# Altium project MCU.PrjPcb (part 1 of 3)
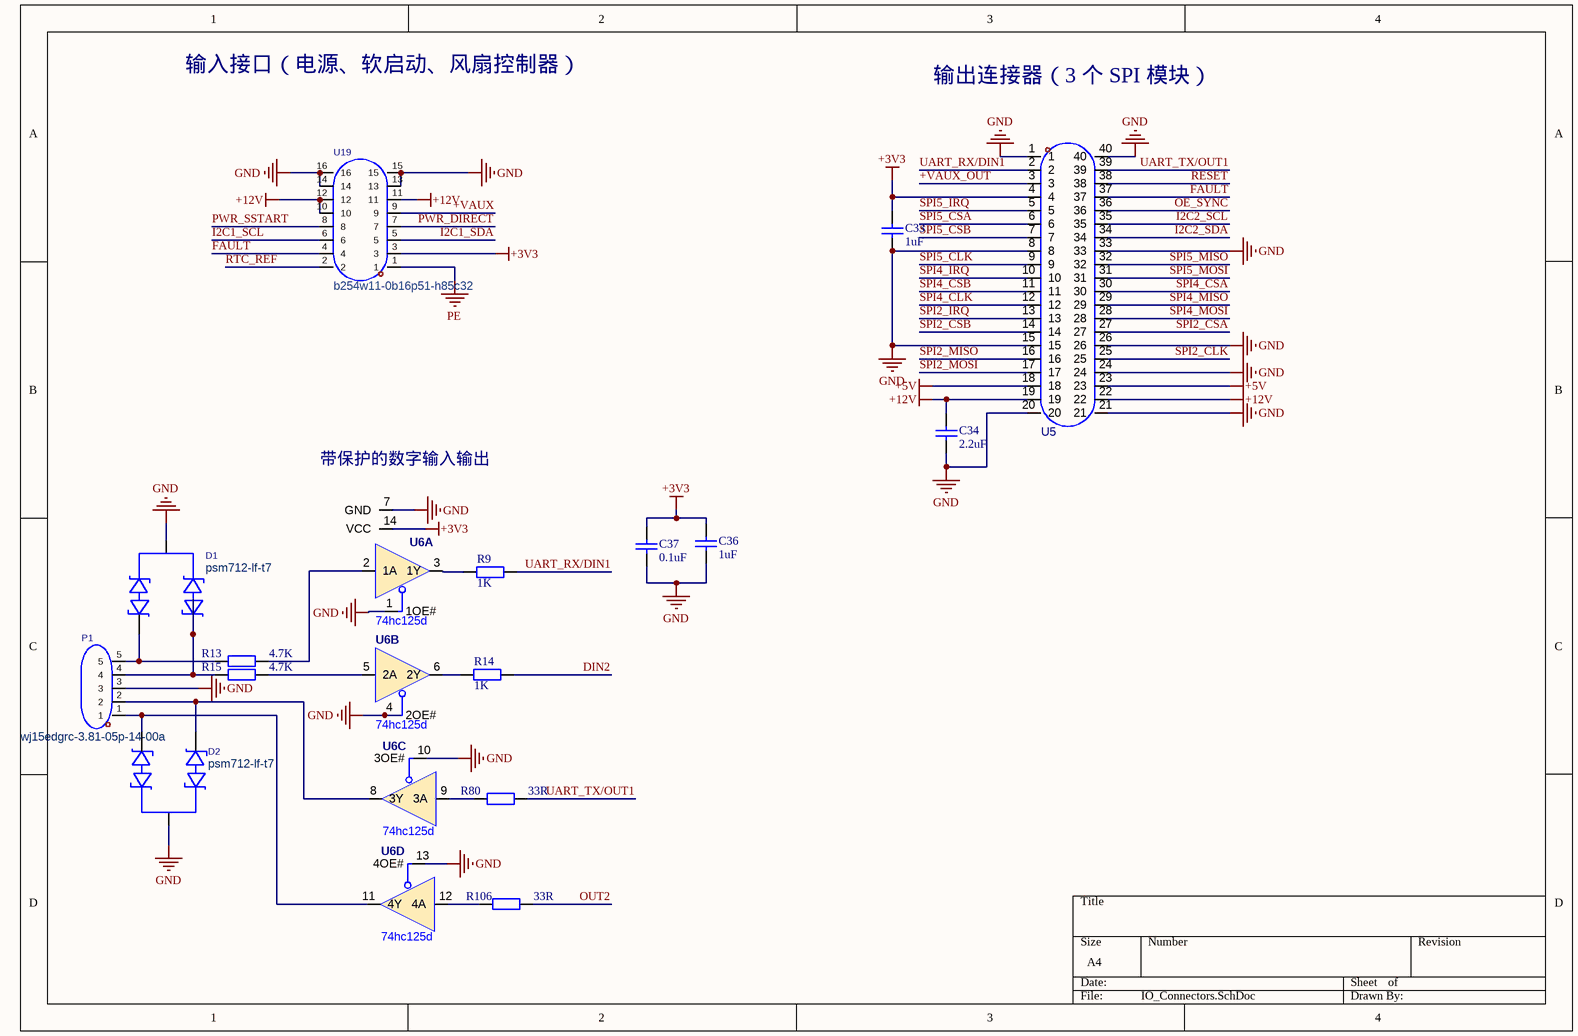
[diagram p0: IO_Connectors.SchDoc]
18 sheets, 591 parts. Net scope: global (net labels, ports and power ports of the same name join across sheets).
Board file: MCU.PcbDoc
Sheets:
  MCU.SchDoc
  IO_Connectors.SchDoc
  SDRAM，JTAG，I2C EEPROM，SD Card.SchDoc
  USB,TFT LCD,touchscreen,audio amplifier.SchDoc
  Ethernet_PHY_1.SchDoc
  Ethernet_PHY_2.SchDoc
  TYPE-C.SchDoc
  CAN.SchDoc
  EMMC.SchDoc
  OSPI_FLASH、EEPROM.SchDoc
  BOOT_MODE_BUFFER&SWITCHES.SchDoc
  MIMP.SchDoc
  DDR4.SchDoc
  sys-power.SchDoc
  bootload_wifi.SchDoc
  SoC POWER SUPPLY.SchDoc
  PERIPHERAL POWER SUPPLY.SchDoc
  VCC3V3_SYS & VCC_5V0 POWER SUPPLY.SchDoc

## Sheet MCU.SchDoc
size 381 x 241 mm; SheetNumber: 1; SheetTotal: 10

## Sheet IO_Connectors.SchDoc
size A4; SheetNumber: 2; SheetTotal: 17

### Parts
(Parts that share a designator on the sheet are numbered #1, #2 ... from top to bottom, then left to right.)
C33  1uF  [C0603]
C34  2.2uF  [C0603]
C36  1uF  [C0603]
C37#1  0.1uF  [C0603]
D1  psm712-lf-t7  [SOT-23-3_L3.0-W1.7-P0.95-LS2.9-BR]
D2  psm712-lf-t7  [SOT-23-3_L3.0-W1.7-P0.95-LS2.9-BR]
P1  wj15edgrc-3.81-05p-14-00a  [CONN-TH_5P-P3.81_WJ15EDGRC-3.81-5P]
R9  1K  [R0603]
R13  4.7K  [R0603]
R14  1K  [R0603]
R15  4.7K  [R0603]
R80  33R  [R0603]
R106  33R  [R0603]
U5  ds1024-2x20r2  [HDR-TH_40P-P2.54-H-F-R2-C20-S2.54-W8.5]  (value not drawn)
U6  74hc125d  [SOIC-14_L8.7-W3.9-P1.27-LS6.0-BL]  (parts A,B,C,D of 4)
U19  b254w11-0b16p51-h85c32  [HDR-TH_16P-P2.54-H-F-R2-C8-W8.5]

### Nets
+3V3: C33.1 C36.2 C37#1.2 U5.4 U6.14(VCC) U19.3
+5V: U5.18 U5.23
+12V: C34.2 U5.19 U5.22 U19.10 U19.11 U19.12
GND: C33.2 C34.1 C36.1 C37#1.1 D1.3(K) D2.3(K) P1.3 U5.1 U5.8 U5.15 U5.20 U5.21 U5.24 U5.26 U5.33 U5.40 U6.1(1OE#) U6.4(2OE#) U6.7(GND) U6.10(3OE#) U6.13(4OE#) U19.13 U19.14 U19.15 U19.16
PE: U19.1
+VAUX: U19.9
+VAUX_OUT: U5.3
DIN2: R14.1
FAULT: U5.37 U19.4
I2C1_SCL: U19.6
I2C1_SDA: U19.5
I2C2_SCL: U5.35
I2C2_SDA: U5.34
OE_SYNC: U5.36
OUT2: R106.2
PWR_DIRECT: U19.7
PWR_SSTART: U19.8
RESET: U5.38
RTC_REF: U19.2
SPI2_CLK: U5.25
SPI2_CSA: U5.27
SPI2_CSB: U5.14
SPI2_IRQ: U5.13
SPI2_MISO: U5.16
SPI2_MOSI: U5.17
SPI4_CLK: U5.12
SPI4_CSA: U5.30
SPI4_CSB: U5.11
SPI4_IRQ: U5.10
SPI4_MISO: U5.29
SPI4_MOSI: U5.28
SPI5_CLK: U5.9
SPI5_CSA: U5.6
SPI5_CSB: U5.7
SPI5_IRQ: U5.5
SPI5_MISO: U5.32
SPI5_MOSI: U5.31
UART_RX/DIN1: R9.1 U5.2
UART_TX/OUT1: R80.2 U5.39
NetD1_1: D1.1(A1) P1.5 R13.1
NetD1_2: D1.2(A1) P1.4 R15.1
NetD2_1: D2.1(A1) P1.2 U6.8(3Y)
NetD2_2: D2.2(A1) P1.1 U6.11(4Y)
NetR9_2: R9.2 U6.3(1Y)
NetR13_2: R13.2 U6.2(1A)
NetR14_2: R14.2 U6.6(2Y)
NetR15_2: R15.2 U6.5(2A)
NetR80_1: R80.1 U6.9(3A)
NetR106_1: R106.1 U6.12(4A)

### Notes on the sheet
- 输入接口（电源、软启动、风扇控制器）
- 输出连接器（3 个 SPI 模块）
- (near U6) 带保护的数字输入输出

### Library data of the parts
C33 C34 C36 C37#1 = C0603: Capacitor; Value: 104; Published: 8-Jun-2000; LatestRevisionDate: 17-Jul-2002; LatestRevisionNote: Re-released for DXP Platform.; Publisher: Altium Limited
D1 D2 = psm712-lf-t7: 极性:单向;反向截止电压(Vrwm):12V;钳位电压:19V;峰值脉冲电流(Ipp):34A@8/20us；30A@8/20us;峰值脉冲功率(Ppp):600W@8/20us;击穿电压(VBR):13.3V;; Manufacturer: PROTEK; AddInBom: yes; ModelId: 89cb27a44ab2466697082bb9fd73a7d0; ModelName: SOT-23-3L_L2.9-W1.6-H1.1-LS2.8-P0.95; ModelTransform: 114.173,110.236,0,90,0,0,0,0,0; Polarity: 单向; Reverse Stand-Off Voltage (Vrwm): 12V; Clamping Voltage: 19V; Voltage - Breakdown: 13.3V; Reverse Leakage Current (Ir): 1uA；20uA; level of protection: IEC 61000-4-4；IEC 61000-4-5；IEC 61000-4-2; Type: TVS; Junction Capacitance: 75pF; Symbol: PSM712-LF-T7; LCSC Part Name: 单向TVS 12V截止 峰值浪涌电流：34A@8/20us 30A@8/20us; SupplierPart: C32677; ManufacturerPart: PSM712-LF-T7; Supplier Footprint: SOT-23; JLCPCB Part Class: Basic Part; Datasheet: https://item.szlcsc.com/datasheet/PSM712-LF-T7/33642.html; Supplier: LCSC; ConvertToPcb: yes; FootprintName: SOT-23-3_L3.0-W1.7-P0.95-LS2.9-BR; Peak Pulse Current (Ipp): 34A@8/20us；30A@8/20us; Peak Pulse Power Dissipation (Ppp): 600W@8/20us; Operating Temperature: -55℃~+150℃
P1 = wj15edgrc-3.81-05p-14-00a: 连接器类型:板端/插座-闭口;固定方式:无固定装置;结构:1x5P;间距:3.81mm;颜色:绿色;安装方式:弯插;排数:1;每排PIN数:5;额定电流:8A;额定电压:300V;线规 - AWG:-;线规 - 平方毫米:-;工作温度:-40℃~+105℃;; Manufacturer: KANGNEX(康奈克斯电气); Symbol: WJ15EDGRC-3.81-5P; AddInBom: yes; ModelId: 1f5bfc586d7a497a94e16b2138b9ad12; ModelName: CONN-TH_WJ3.81-WI-5P; ModelTransform: 784.64406,360.2355,0,0,0,0,-0.197,-118.11,-137.795; Number of Positions or Pins: 1x5P; Pitch: 3.81mm; Number of PINs Per Row: 5; Current Rating: 8A; Voltage Rating (Max): 300V; LCSC Part Name: 无固定装置 1x5P 3.81mm 排数:1 每排P数:5; SupplierPart: C8395; ManufacturerPart: WJ15EDGRC-3.81-05P-14-00A; Supplier Footprint: 弯插,P=3.81mm; JLCPCB Part Class: Extended Part; Datasheet: https://item.szlcsc.com/datasheet/WJ15EDGRC-3.81-05P-14-00A/8889.html; Supplier: LCSC; ConvertToPcb: yes; FootprintName: CONN-TH_5P-P3.81_WJ15EDGRC-3.81-5P; Connector Type: 板端/插座-闭口; Termination Style: 无固定装置; Color: 绿色; Mounting Type: 弯插; Number of Pins: 5P; Number of Rows: 1; Wire Gauge - AWG: -; Wire Gauge - mm2: -; Operating Temperature: -40℃~+105℃; Connection Type: -; Outlet Direction (Vertical Basis): -
R9 R13-R15 R80 R106 = R0603: Resistor; Published: 8-Jun-2000; LatestRevisionDate: 17-Jul-2002; LatestRevisionNote: Re-released for DXP Platform.; Publisher: Altium Limited
U5 = ds1024-2x20r2: 插孔结构:2x20P;间距:2.54mm;行距:2.54mm;圆孔/方孔:方孔;安装方式:弯插;排数:双排;总孔位数:40P;额定电流:3A;额定电压:250V;插孔方向:侧面;塑高:2.5mm;触头镀层:金镍;工作温度:-40℃~+105℃;; Manufacturer: CONNFLY; AddInBom: yes; ModelId: a9ccadb72efd4c37a205c7e50d3d2ca6; ModelTransform: 2023.618,499.999,0,180,0,0,0,192.917,-125.984; Holes Structure: 2x20P; Pitch: 2.54mm; Circular Hole / Square Hole: 方孔; Number of Positions: 40P; Current Rating: 3A; Voltage Rating (Max): 250V; Holes Direction: 侧面; Symbol: DS1024-2X20R2; LCSC Part Name: 黑色 2x20P 间距:2.54mm 弯插; SupplierPart: C7509545; ManufacturerPart: DS1024-2x20R2; Supplier Footprint: 弯插,P=2.54mm; JLCPCB Part Class: Extended Part; Datasheet: https://item.szlcsc.com/datasheet/DS1024-2x20R2/8601981.html; Supplier: LCSC; ConvertToPcb: yes; FootprintName: HDR-TH_40P-P2.54-H-F-R2-C20-S2.54-W8.5; ModelName: HDR-TH_40P-P2.54-H-F-R2-C20-S2.54-W8.5; Row Spacing: 2.54mm; Mounting Type: 弯插; Number of Rows: 双排; Insulation Height: 2.5mm; Contact Plating: 金镍; Operating Temperature: -40℃~+105℃
U6 = 74hc125d_c52140399: 输入类型:标准CMOS;工作电压:2V~6V;元件数:4;每个元件位数:-;灌电流(IOL):7.8mA;拉电流(IOH):7.8mA;; Manufacturer: MDD(辰达半导体); AddInBom: yes; ModelId: 8dbf5b715d42428c85558507ae5a252b; ModelName: SOIC-14_L8.6-W3.9-H1.8-LS6.0-P1.27; ModelTransform: 338.583,236.22,0,0,0,0,0,0.001,0; Input type: 标准CMOS; output type: 三态; Voltage - Supply: 2V~6V; Number of Elements: 4; Channel Type: 单向; Current - Output Low(IOL): 7.8mA; Logic Family: 74HC; Quiescent Current: 40uA; Propagation Delay: 20ns@6.0V,15pF; LCSC Part Name: 带三态输出的四路缓冲器/线路驱动器; SupplierPart: C52140399; ManufacturerPart: 74HC125D; Supplier Footprint: SOP-14L; JLCPCB Part Class: Extended Part; Datasheet: https://item.szlcsc.com/datasheet/74HC125D/54938128.html; Supplier: LCSC; ConvertToPcb: yes; SymbolName: 74HC125D_C52140399; FootprintName: SOIC-14_L8.7-W3.9-P1.27-LS6.0-BL; Number of Bits per Element: -; Current - Output High(IOH): 7.8mA; Operating Temperature: -40℃~+125℃; Features: 输出使能
U19 = b254w11-0b16p51-h85c32: 插孔结构:2x8P;间距:2.54mm;行距:2.54mm;圆孔/方孔:方孔;安装方式:弯插;排数:双排;总孔位数:16P;额定电流:3A;插孔方向:侧面;塑高:8.5mm;触头材质:黄铜;触头镀层:金;工作温度:-40℃~+105℃;; Manufacturer: JXTCONN(聚兴泰); AddInBom: yes; ModelId: 3769f9c01991404e933d2dcd4e3e6b52; ModelTransform: 823.62,499.999,0,0,0,0,0,-192.913,-125.984; Holes Structure: 2x8P; Pitch: 2.54mm; Circular Hole / Square Hole: 方孔; Number of Positions: 16P; Current Rating: 3A; Holes Direction: 侧面; PIN Length: 3.2mm; Symbol: B254W11-0B16P51-H85C32; LCSC Part Name: 插孔结构：2x8P 间距：2.54mm 安装方式：弯插 排数：双排 方孔; SupplierPart: C49297019; ManufacturerPart: B254W11-0B16P51-H85C32; Supplier Footprint: 弯插,P=2.54mm; JLCPCB Part Class: Extended Part; Datasheet: https://item.szlcsc.com/datasheet/B254W11-0B16P51-H85C32/51751274.html; Supplier: LCSC; ConvertToPcb: yes; FootprintName: HDR-TH_16P-P2.54-H-F-R2-C8-W8.5; ModelName: HDR-TH_16P-P2.54-H-F-R2-C8-W8.5; Row Spacing: 2.54mm; Mounting Type: 弯插; Number of Rows: 双排; Insulation Height: 8.5mm; Contact Material: 黄铜; Contact Plating: 金; Operating Temperature: -40℃~+105℃

## Sheet SDRAM，JTAG，I2C EEPROM，SD Card.SchDoc
size A4; SheetNumber: 3; SheetTotal: 16
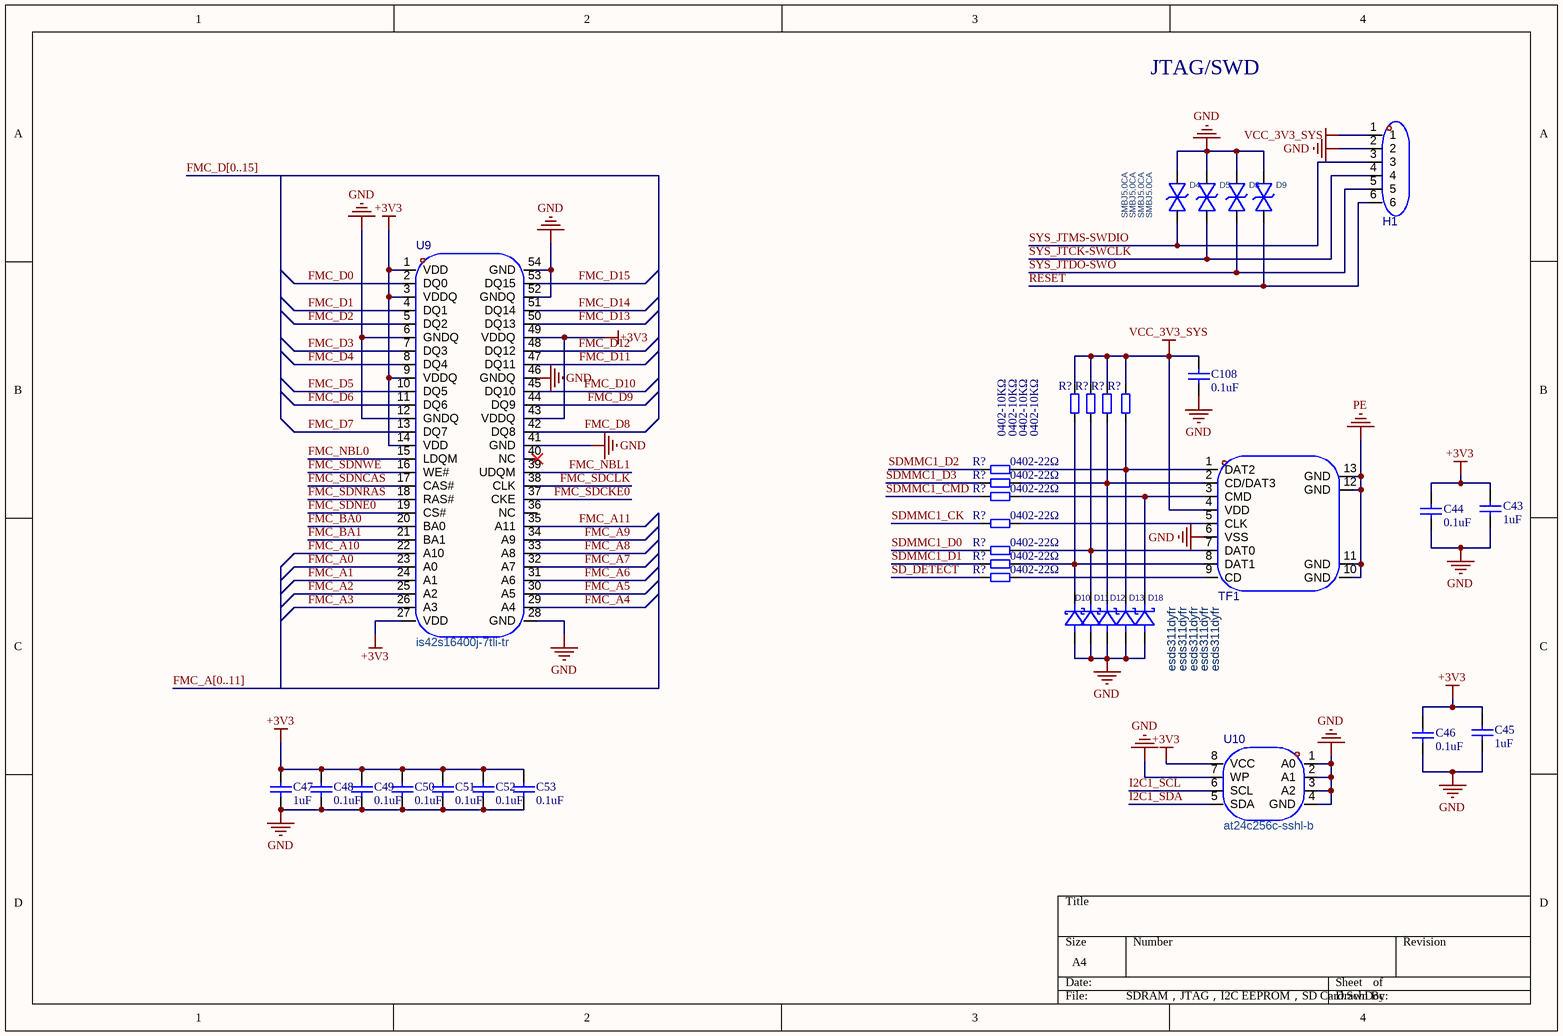
[diagram p1: SDRAM，JTAG，I2C EEPROM，SD Card.SchDoc]

### Parts
(Parts that share a designator on the sheet are numbered #1, #2 ... from top to bottom, then left to right.)
C43  1uF  [C0603]
C44  0.1uF  [C0603]
C45  1uF  [C0603]
C46  0.1uF  [C0603]
C47  1uF  [C0603]
C48  0.1uF  [C0603]
C49  0.1uF  [C0603]
C50  0.1uF  [C0603]
C51  0.1uF  [C0603]
C52  0.1uF  [C0603]
C53  0.1uF  [C0603]
C108  0.1uF  [C0603]
D4  SMBJ5.0CA  [SMB_L4.6-W3.6-LS5.3-BI]
D5  SMBJ5.0CA  [SMB_L4.6-W3.6-LS5.3-BI]
D8  SMBJ5.0CA  [SMB_L4.6-W3.6-LS5.3-BI]
D9  SMBJ5.0CA  [SMB_L4.6-W3.6-LS5.3-BI]
D10  esds311dyfr  [SOD-323_L1.7-W1.3-LS2.6-RD-1]
D11  esds311dyfr  [SOD-323_L1.7-W1.3-LS2.6-RD-1]
D12  esds311dyfr  [SOD-323_L1.7-W1.3-LS2.6-RD-1]
D13  esds311dyfr  [SOD-323_L1.7-W1.3-LS2.6-RD-1]
D18  esds311dyfr  [SOD-323_L1.7-W1.3-LS2.6-RD-1]
H1  pz254v-11-06p  [HDR-TH_6P-P2.54-V-M]  (value not drawn)
R?#1  0402-10KΩ  [R0402]
R?#2  0402-10KΩ  [R0402]
R?#3  0402-10KΩ  [R0402]
R?#4  0402-10KΩ  [R0402]
R?#5  0402-22Ω  [R0402]
R?#6  0402-22Ω  [R0402]
R?#7  0402-22Ω  [R0402]
R?#8  0402-22Ω  [R0402]
R?#9  0402-22Ω  [R0402]
R?#10  0402-22Ω  [R0402]
R?#11  0402-22Ω  [R0402]
TF1  tf-card h1.8  [TF-SMD_TF-CARD-H1.8]  (value not drawn)
U9  is42s16400j-7tli-tr  [TSOP-54_L22.2-W10.2-P0.80-LS11.8-BL]
U10  at24c256c-sshl-b  [SOIC-8_L4.9-W3.9-P1.27-LS6.0-BL]

### Nets
+3V3: C43.2 C44.2 C45.2 C46.2 C47.2 C48.2 C49.2 C50.2 C51.2 C52.2 C53.2 U9.1(VDD) U9.3(VDDQ) U9.9(VDDQ) U9.14(VDD) U9.27(VDD) U9.43(VDDQ) U9.49(VDDQ) U10.8(VCC)
GND: C43.1 C44.1 C45.1 C46.1 C47.1 C48.1 C49.1 C50.1 C51.1 C52.1 C53.1 C108.1 D4.2 D5.2 D8.2 D9.2 D10.2(A) D11.2(A) D12.2(A) D13.2(A) D18.2(A) H1.2 TF1.6(VSS) U9.6(GNDQ) U9.12(GNDQ) U9.28(GND) U9.41(GND) U9.46(GNDQ) U9.52(GNDQ) U9.54(GND) U10.1(A0) U10.2(A1) U10.3(A2) U10.4(GND) U10.7(WP)
PE: TF1.10(GND) TF1.11(GND) TF1.12(GND) TF1.13(GND)
VCC_3V3_SYS: C108.2 H1.1 R?#1.2 R?#2.2 R?#3.2 R?#4.2 TF1.4(VDD)
FMC_A0: U9.23(A0)
FMC_A1: U9.24(A1)
FMC_A2: U9.25(A2)
FMC_A3: U9.26(A3)
FMC_A4: U9.29(A4)
FMC_A5: U9.30(A5)
FMC_A6: U9.31(A6)
FMC_A7: U9.32(A7)
FMC_A8: U9.33(A8)
FMC_A9: U9.34(A9)
FMC_A10: U9.22(A10)
FMC_A11: U9.35(A11)
FMC_BA0: U9.20(BA0)
FMC_BA1: U9.21(BA1)
FMC_D0: U9.2(DQ0)
FMC_D1: U9.4(DQ1)
FMC_D2: U9.5(DQ2)
FMC_D3: U9.7(DQ3)
FMC_D4: U9.8(DQ4)
FMC_D5: U9.10(DQ5)
FMC_D6: U9.11(DQ6)
FMC_D7: U9.13(DQ7)
FMC_D8: U9.42(DQ8)
FMC_D9: U9.44(DQ9)
FMC_D10: U9.45(DQ10)
FMC_D11: U9.47(DQ11)
FMC_D12: U9.48(DQ12)
FMC_D13: U9.50(DQ13)
FMC_D14: U9.51(DQ14)
FMC_D15: U9.53(DQ15)
FMC_NBL0: U9.15(LDQM)
FMC_NBL1: U9.39(UDQM)
FMC_SDCKE0: U9.37(CKE)
FMC_SDCLK: U9.38(CLK)
FMC_SDNCAS: U9.17(CAS#)
FMC_SDNE0: U9.19(CS#)
FMC_SDNRAS: U9.18(RAS#)
FMC_SDNWE: U9.16(WE#)
I2C1_SCL: U10.6(SCL)
I2C1_SDA: U10.5(SDA)
RESET: D9.1 H1.6
SD_DETECT: R?#11.1
SDMMC1_CK: R?#8.1
SDMMC1_CMD: R?#7.1
SDMMC1_D0: R?#9.1
SDMMC1_D1: R?#10.1
SDMMC1_D2: R?#5.1
SDMMC1_D3: R?#6.1
SYS_JTCK-SWCLK: D5.1 H1.4
SYS_JTDO-SWO: D8.1 H1.5
SYS_JTMS-SWDIO: D4.1 H1.3
NetD10_1: D10.1(K) R?#1.1 R?#10.2 TF1.8(DAT1)
NetD11_1: D11.1(K) R?#2.1 R?#9.2 TF1.7(DAT0)
NetD12_1: D12.1(K) R?#3.1 R?#6.2 TF1.2(CD/DAT3)
NetD13_1: D13.1(K) R?#4.1 R?#5.2 TF1.1(DAT2)
NetD18_1: D18.1(K) R?#7.2 TF1.3(CMD)
NetR?#8_2: R?#8.2 TF1.5(CLK)
NetR?#11_2: R?#11.2 TF1.9(CD)

Not connected (* = marked no-connect by the designer): U9 36(NC) 40(NC)*

### Buses and harness runs
bus \ = FMC_A[0..11]
bus FMC_D[0..15]

### Notes on the sheet
- JTAG/SWD

### Library data of the parts
C43-C53 C108 = C0603: Capacitor; Value: 104; Published: 8-Jun-2000; LatestRevisionDate: 17-Jul-2002; LatestRevisionNote: Re-released for DXP Platform.; Publisher: Altium Limited
D4 D5 D8 D9 = SMBJ5.0CA_C19077559: PWR 5V; Manufacturer: 宏嘉诚; Add into BOM: yes; Polarity: 双向; Clamping Voltage: 9.2V; Peak Pulse Current (Ipp): 65.22A; Peak Pulse Power Dissipation (Ppp): 600W; Voltage - Breakdown: 7V; Reverse Leakage Current (Ir): 800uA; Type: TVS; Symbol: SMBJ5.0CA_C19077559; Device: SMBJ5.0CA_C19077559; LCSC Part Name: SMBJ5.0CA; Supplier Part: C19077559; Manufacturer Part: SMBJ5.0CA; Supplier Footprint: SMB; JLCPCB Part Class: Extended Part; Datasheet: https://atta.szlcsc.com/upload/public/pdf/source/20250107/474F05451FC8AB27D7FA0238914F96F6.pdf; Supplier: LCSC; Convert to PCB: yes; Reverse Stand-Off Voltage (Vrwm): 5V; Operating Temperature: -
D10-D13 D18 = esds311dyfr: 极性:单向;反向截止电压(Vrwm):3.6V;钳位电压:7.7V;峰值脉冲电流(Ipp):25A@8/20us;峰值脉冲功率(Ppp):170W@8/20us;击穿电压(VBR):7.5V;; Manufacturer: TI(德州仪器); AddInBom: yes; ModelId: eba151483b2844ffacda3a6d97308fa1; ModelTransform: 100.394,49.2125,0,0,0,0,0,0,0; Polarity: 单向; Reverse Stand-Off Voltage (Vrwm): 3.6V; Clamping Voltage: 7.7V; Voltage - Breakdown: 7.5V; Reverse Leakage Current (Ir): 5nA; Number of Channels: 单路; level of protection: IEC 61000-4-4；IEC 61000-4-5；IEC 61000-4-2; Type: TVS; Junction Capacitance: 4.5pF; LCSC Part Name: 单向TVS 3.6V截止 峰值浪涌电流：25A@8/20us; SupplierPart: C30938562; ManufacturerPart: ESDS311DYFR; Supplier Footprint: SOD-323; JLCPCB Part Class: Extended Part; Datasheet: https://www.ti.com.cn/cn/lit/ds/symlink/esds311.pdf?ts=1736913524660&ref_url=https%253A%252F%252Fwww.ti.com.cn%252Fsitesearch%252Fzh-cn%252Fdocs%252Funiversalsearch.tsp%253FlangPref%253Dzh-CN%2526nr%253D9%2526searchTerm%253DESDS311DYFR; Supplier: LCSC; ConvertToPcb: yes; SymbolName: ESDS311DYFR; FootprintName: SOD-323_L1.7-W1.3-LS2.6-RD-1; ModelName: SOD-323_L1.7-W1.3-LS2.6-RD-1; Peak Pulse Current (Ipp): 25A@8/20us; Peak Pulse Power Dissipation (Ppp): 170W@8/20us; Operating Temperature: -40℃~+125℃
H1 = pz254v-11-06p: 插针结构:1x6P;间距:2.54mm;行距:-;圆针/方针:方针;安装方式:直插;排数:单排;总PIN位数:6P;额定电流:3A;额定电压:250V;配合针长度:6mm;塑高:2.5mm;端接针长度:3mm;触头材质:黄铜;触头镀层:-;工作温度:-40℃~+105℃;颜色:黑色;; Manufacturer: XFCN(兴飞); AddInBom: yes; ModelId: 66a147c6933d4029b68665bbcd1e2924; ModelName: HDR-TH_6P-P2.54-M-LI-1X6P; ModelTransform: 590.1563,98.425,0,0,0,0,0,0,-118.11; Pin Structure: 1x6P; Pitch: 2.54mm; Circluar Pins/Square Pins: 方针; Current Rating: 3A; Voltage Rating (Max): 250V; Symbol: PZ254V-11-06P; LCSC Part Name: 1x6P 间距:2.54mm 方针 直插; SupplierPart: C492405; ManufacturerPart: PZ254V-11-06P; Supplier Footprint: 插件,P=2.54mm; JLCPCB Part Class: Extended Part; Datasheet: https://item.szlcsc.com/datasheet/PZ254V-11-06P/502961.html; Supplier: LCSC; ConvertToPcb: yes; FootprintName: HDR-TH_6P-P2.54-V-M; Row Spacing: -; Mounting Type: 直插; Number of Rows: 单排; Number of Pins: 6P; Length of Mating Pin: 6mm; Insulation Height: 2.5mm; Length of End Connection Pin: 3mm; Contact Material: 黄铜; Contact Plating: -; Operating Temperature: -40℃~+105℃; Color: 黑色
R?#1-R?#11 = R0402: 片式电阻; 物料描述: 片式电阻器-0805-10KΩ-5%-JT; 物料号: NA
TF1 = tf-card h1.8: 卡连接方式:自弹式;卡类型:MicroSD卡(TF卡);连接器类型:卡座;本体最大高度:1.8mm;工作温度:-40℃~+70℃;; Manufacturer: SHOU HAN(首韩); AddInBom: yes; ModelId: 9b9c093eaf784fafb0b50515d8d92d39; ModelTransform: 631.8885,594.487,0,0,0,0,-0.002,-75.432,-23.622; Card Connection Mode: 自弹式; Connector Type: 卡座; Symbol: TF-CARD H1.8; LCSC Part Name: 9P，自弹式TF卡座; SupplierPart: C7529389; ManufacturerPart: TF-CARD H1.8; Supplier Footprint: SMD; JLCPCB Part Class: Extended Part; Datasheet: https://item.szlcsc.com/datasheet/TF-CARD%2520H1.8/8629776.html; Supplier: LCSC; ConvertToPcb: yes; FootprintName: TF-SMD_TF-CARD-H1.8; ModelName: TF-SMD_TF-CARD-H1.8; Card Type: MicroSD卡(TF卡); Additional Card Detection Pins: -; Supplementary Features: -; Height Above Board: 1.8mm; Operating Temperature: -40℃~+70℃
U9 = is42s16400j-7tli-tr: 存储容量:64Mbit;时钟频率(fc):200MHz;; Manufacturer: ISSI(美国芯成); AddInBom: yes; ModelId: 700c07346ffc4ca1812a693d2a0f333f; ModelName: TSOP-54_L22.2-W10.2-H1.2-LS11.8-P0.80; ModelTransform: 464.567,872.538,0,90,0,0,0,-0.0005,0; Memory Size: 64Mbit; Clock Frequency: 200MHz; Voltage - Supply: 3V~3.6V; Symbol: IS42S16400J-7TLI; LCSC Part Name: 停产 64Mb同步动态随机存取存储器; SupplierPart: C94865; ManufacturerPart: IS42S16400J-7TLI-TR; Supplier Footprint: TSOPII-54-10.2mm; JLCPCB Part Class: Extended Part; Datasheet: https://item.szlcsc.com/datasheet/IS42S16400J-7TLI-TR/96065.html; Supplier: LCSC; ConvertToPcb: yes; FootprintName: TSOP-54_L22.2-W10.2-P0.80-LS11.8-BL; Operating Temperature: -40℃~+85℃
U10 = at24c256c-sshl-b_c615461: 接口类型:I2C;存储容量:256Kbit;时钟频率(fc):1MHz;; Manufacturer: MICROCHIP(美国微芯); AddInBom: yes; ModelId: e81d2f7d937b4a6ab1dca543ff5d56a4; ModelName: SOIC-8_L4.9-W3.9-H1.7-LS6.0-P1.27; ModelTransform: 192.913,236.22,0,0,0,0,0,0,0; Interface: I2C; Clock Frequency: 1MHz; Write Cycle Time(Tw): 5ms; Data Retention - TDR (Year): 100年; Write Cycle Endurance: 100万次; Voltage - Supply: 1.7V~5.5V; Symbol: AT24C256C-SSHL-B; LCSC Part Name: 支持I²C接口的串行EEPROM; SupplierPart: C615461; ManufacturerPart: AT24C256C-SSHL-B; Supplier Footprint: SOIC-8; JLCPCB Part Class: Extended Part; Datasheet: https://item.szlcsc.com/datasheet/AT24C256C-SSHL-B/645439.html; Supplier: LCSC; ConvertToPcb: yes; FootprintName: SOIC-8_L4.9-W3.9-P1.27-LS6.0-BL; Memory Size: 256Kbit; Features: 内置上电复位(POR)；硬件写保护功能；噪声抑制功能; Operating Temperature: -40℃~+85℃

## Sheet USB,TFT LCD,touchscreen,audio amplifier.SchDoc
size A4; SheetNumber: 4; SheetTotal: 18
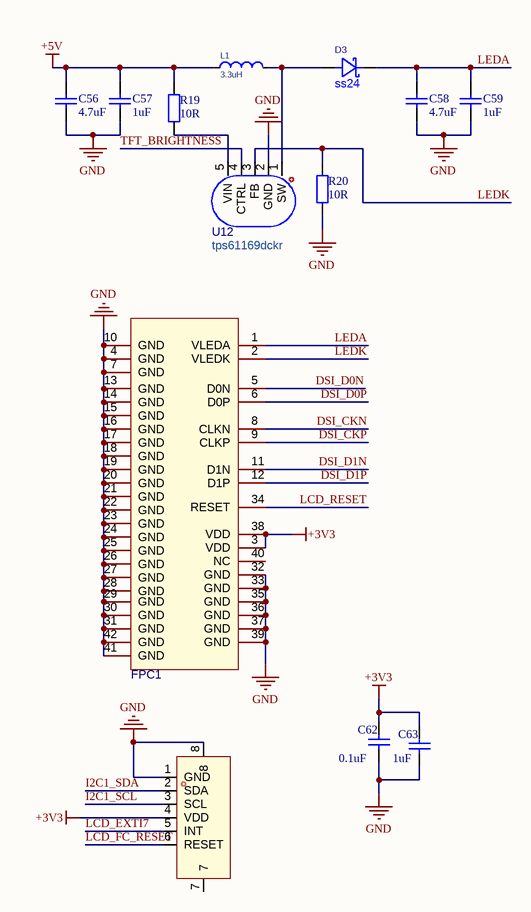
[diagram p2: USB,TFT LCD,touchscreen,audio amplifier.SchDoc]

### Parts
C56  4.7uF  [C0603]
C57  1uF  [C0603]
C58  4.7uF  [C0603]
C59  1uF  [C0603]
C62  0.1uF  [C0603]
C63  1uF  [C0603]
D3  ss24  [SMA_L4.3-W2.6-LS5.0-FD]
FPC1  afc01-s40fca-00  [FPC-SMD_AFC01-S40FCA-00]  (value not drawn)
FPC2  fpc-05f-6ph20  [FPC-SMD_6P-P0.50_XUNPU_FPC-05F-6PH20]  (value not drawn)
L1  3.3uH  [IND-SMD_L3.9-W3.9-1]
R19  10R  [R0603]
R20  10R  [R0603]
U12  tps61169dckr  [SC-70-5_L2.1-W1.3-P0.65-LS2.1-BR]

### Nets
+3V3: C62.1 C63.1 FPC1.3(VDD) FPC1.38(VDD) FPC2.4(VDD)
+5V: C56.2 C57.2 L1.1 R19.2
GND: C56.1 C57.1 C58.1 C59.1 C62.2 C63.2 FPC1.4(GND) FPC1.7(GND) FPC1.10(GND) FPC1.13(GND) FPC1.14(GND) FPC1.15(GND) FPC1.16(GND) FPC1.17(GND) FPC1.18(GND) FPC1.19(GND) FPC1.20(GND) FPC1.21(GND) FPC1.22(GND) FPC1.23(GND) FPC1.24(GND) FPC1.25(GND) FPC1.26(GND) FPC1.27(GND) FPC1.28(GND) FPC1.29(GND) FPC1.30(GND) FPC1.31(GND) FPC1.32(GND) FPC1.33(GND) FPC1.35(GND) FPC1.36(GND) FPC1.37(GND) FPC1.39(GND) FPC1.41(GND) FPC1.42(GND) FPC2.1(GND) FPC2.8 R20.1 U12.2(GND)
DSI_CKN: FPC1.8(CLKN)
DSI_CKP: FPC1.9(CLKP)
DSI_D0N: FPC1.5(D0N)
DSI_D0P: FPC1.6(D0P)
DSI_D1N: FPC1.11(D1N)
DSI_D1P: FPC1.12(D1P)
I2C1_SCL: FPC2.3(SCL)
I2C1_SDA: FPC2.2(SDA)
LCD_EXTI7: FPC2.5(INT)
LCD_FC_RESET: FPC2.6(RESET)
LCD_RESET: FPC1.34(RESET)
LEDA: C58.2 C59.2 D3.2(K) FPC1.1(VLEDA)
LEDK: FPC1.2(VLEDK) R20.2 U12.3(FB)
TFT_BRIGHTNESS: U12.4(CTRL)
NetD3_1: D3.1(A) L1.2 U12.1(SW)
NetR19_1: R19.1 U12.5(VIN)

Not connected (* = marked no-connect by the designer): FPC1 40(NC); FPC2 7

### Library data of the parts
C56-C59 = C0603_1: Capacitor; Value: 104; Published: 8-Jun-2000; LatestRevisionDate: 17-Jul-2002; LatestRevisionNote: Re-released for DXP Platform.; Publisher: Altium Limited
C62 C63 = C0603: CAP CER 0.1UF 50V, 10% X7R 0603; Value: 104; Published: 8-Jun-2000; LatestRevisionDate: 17-Jul-2002; LatestRevisionNote: Re-released for DXP Platform.; Publisher: Altium Limited
D3 = ss34_c7420365: 二极管配置:独立式;正向压降(Vf):550mV@3A;直流反向耐压(Vr):40V;整流电流:3A;; Manufacturer: R+O(宏嘉诚); ManufacturerPart: SS34; AddInBom: yes; ModelId: 7e24bebe6cd74171ae8c9de6fc5b78aa; ModelTransform: 198.4248,103.5431,0,180,0,0,-0.001,0,0; Diode Configuration: 独立式; Voltage - DC Reverse(Vr): 40V; Current - Rectified: 3A; Reverse Leakage Current (Ir): 200uA@40V; Symbol: SS34_C7420365; LCSC Part Name: 电压:40V 电流:3A; SupplierPart: C7420365; Supplier Footprint: SMA(DO-214AC); JLCPCB Part Class: Extended Part; Datasheet: https://item.szlcsc.com/datasheet/SS34/8397187.html; Supplier: LCSC; ConvertToPcb: yes; FootprintName: SMA_L4.3-W2.6-LS5.0-FD; ModelName: SMA_L4.3-W2.6-LS5.0-FD; Voltage - Forward(Vf@If): 550mV@3A
FPC1 = afc01-s40fca-00: 锁定特性:翻盖式;触点类型:下接;触点数量:40P;间距:0.5mm;安装方式:卧贴;工作温度:-45℃~+85℃;; Manufacturer: JS(钜硕电子); AddInBom: yes; ModelId: 458e5f3c71f743329f5584acd337d3c8; ModelTransform: 961.0217,240.157,0,0,0,0,0,-52.441,0; Locking Feature: 翻盖式; Number of Contacts: 40P; Pitch: 0.5mm; FFC, FCB Thickness: 0.3mm; Rated Voltage (Max): 50V; Current Rating (Max): 500mA; Symbol: AFC01-S40FCA-00; LCSC Part Name: 翻盖式 下接 P数:40P 间距:0.5mm; SupplierPart: C262674; ManufacturerPart: AFC01-S40FCA-00; Supplier Footprint: SMD,P=0.5mm,卧贴; JLCPCB Part Class: Extended Part; Datasheet: https://item.szlcsc.com/datasheet/AFC01-S40FCA-00/253933.html; Supplier: LCSC; ConvertToPcb: yes; FootprintName: FPC-SMD_AFC01-S40FCA-00; ModelName: FPC-SMD_AFC01-S40FCA-00; Contact Type: 下接; Mounting Type: 卧贴; Height Above Board: 2mm; Contact Material: 铜合金; Contact Plating: 锡; Operating Temperature: -45℃~+85℃
FPC2 = fpc-05f-6ph20_1: 锁定特性:翻盖式;触点类型:下接;触点数量:6P;间距:0.5mm;安装方式:卧贴;工作温度:-25℃~+85℃;; Manufacturer: XUNPU(讯普); AddInBom: yes; ModelId: f0153d283bb647ab8cc6ddf5c8ee15be; ModelTransform: 291.338,220.472,0,0,0,0,-0.001,-45.276,0; Locking Feature: 翻盖式; Number of Contacts: 6P; Pitch: 0.5mm; FFC, FCB Thickness: 0.3mm; Rated Voltage (Max): 50V; Current Rating (Max): 500mA; Symbol: FPC-05F-6PH20; LCSC Part Name: 翻盖式 下接 P数:6P 间距:0.5mm; SupplierPart: C2856796; ManufacturerPart: FPC-05F-6PH20; Supplier Footprint: SMD,P=0.5mm,卧贴; JLCPCB Part Class: Extended Part; Datasheet: https://item.szlcsc.com/datasheet/FPC-05F-6PH20/3056894.html; Supplier: LCSC; ConvertToPcb: yes; FootprintName: FPC-SMD_6P-P0.50_XUNPU_FPC-05F-6PH20; ModelName: FPC-SMD_6P-P0.50_XUNPU_FPC-05F-6PH20; Contact Type: 下接; Mounting Type: 卧贴; Height Above Board: 2mm; Contact Material: 磷青铜; Contact Plating: 锡; Operating Temperature: -25℃~+85℃
L1 = LPS4018-472MRC: 0805  INDUCTOR MULTILAYER; Manufacturer: TDK; Symbol: MLZ2012A3R3WT000; Add into BOM: yes; Tolerance: ±20%; Saturation Current (Isat): 200mA; DC Resistance (DCR): 340mΩ; Frequency - Self Resonant: 90MHz; Device: MLZ2012A3R3WT000; LCSC Part Name: 3.3uH ±20% 200mA; Supplier Part: C383399; Manufacturer Part: MLZ2012A3R3WT000; Supplier Footprint: 0805; JLCPCB Part Class: Extended Part; Datasheet: https://atta.szlcsc.com/upload/public/pdf/source/20200324/C383404_6F95903E86AEDF16368640ABB3D81E0E.pdf; Supplier: LCSC; Convert to PCB: yes; Value: 3.3uH; Rated Current: -; Q @ Freq: -; Ratings: -
R19 R20 = R0603: Resistor; Published: 8-Jun-2000; LatestRevisionDate: 17-Jul-2002; LatestRevisionNote: Re-released for DXP Platform.; Publisher: Altium Limited
U12 = tps61169dckr: 类型:DC-DC;工作电压(DC):2.7V~5.5V;开关频率:1.2MHz;通道数:1;输出电压:2.7V~38V;输出电流:-;调光:PWM;拓扑结构:升压;; Manufacturer: TI(德州仪器); AddInBom: yes; ModelId: e25de95d33824a3dab7086d8b5286abf; ModelName: SC-70-5_L2.1-W1.3-H1.0-LS2.1-P0.65; ModelTransform: 82.677,78.74,0,180,0,0,0,0,0; Frequency - Switching: 1.2MHz; Number of Channels: 1; Dimming: PWM; Topology: 升压; Switch Tube (Built-In/External): 内置; Symbol: TPS61169DCKR; LCSC Part Name: 采用PWM控制的38V高电流升压WLED驱动器; SupplierPart: C71045; ManufacturerPart: TPS61169DCKR; Supplier Footprint: SC-70-5; JLCPCB Part Class: Extended Part; Datasheet: https://www.ti.com/cn/lit/gpn/tps61169; Supplier: LCSC; ConvertToPcb: yes; FootprintName: SC-70-5_L2.1-W1.3-P0.65-LS2.1-BR; Type: DC-DC; Voltage - Input(DC): 2.7V~5.5V; Output Voltage: 2.7V~38V; Output Current: -; Features: 过温保护(OTP); Voltage - Input(AC): -; Operating temperature: -40℃~+125℃; Constant Current Accuracy: -

## Sheet Ethernet_PHY_1.SchDoc
size A4; SheetNumber: 5; SheetTotal: 11
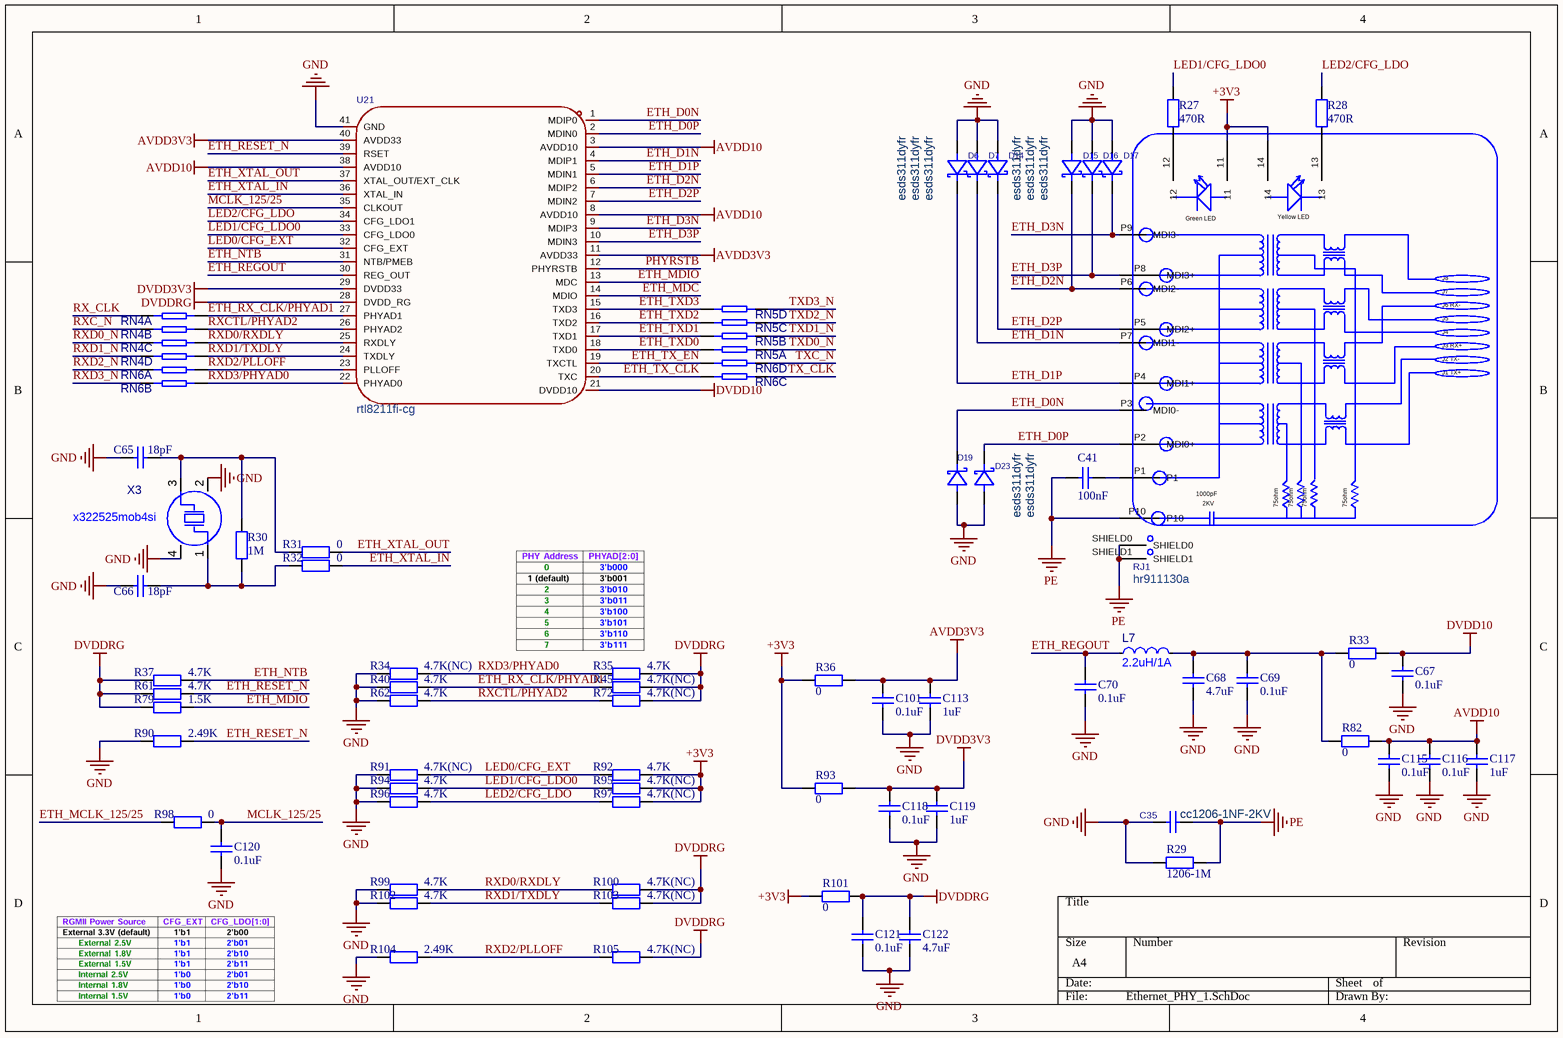
[diagram p3: Ethernet_PHY_1.SchDoc]

### Parts
C35  cc1206-1NF-2KV  [C1206]
C41  100nF  [C0603]
C65  18pF  [C0603]
C66  18pF  [C0603]
C67  0.1uF  [C0603]
C68  4.7uF  [C0603]
C69  0.1uF  [C0603]
C70  0.1uF  [C0603]
C101  0.1uF  [C0603]
C113  1uF  [C0603]
C115  0.1uF  [C0603]
C116  0.1uF  [C0603]
C117  1uF  [C0603]
C118  0.1uF  [C0603]
C119  1uF  [C0603]
C120  0.1uF  [C0603]
C121  0.1uF  [C0603]
C122  4.7uF  [C0603]
D6  esds311dyfr  [SOD-323_L1.7-W1.3-LS2.6-RD-1]
D7  esds311dyfr  [SOD-323_L1.7-W1.3-LS2.6-RD-1]
D14  esds311dyfr  [SOD-323_L1.7-W1.3-LS2.6-RD-1]
D15  esds311dyfr  [SOD-323_L1.7-W1.3-LS2.6-RD-1]
D16  esds311dyfr  [SOD-323_L1.7-W1.3-LS2.6-RD-1]
D17  esds311dyfr  [SOD-323_L1.7-W1.3-LS2.6-RD-1]
D19  esds311dyfr  [SOD-323_L1.7-W1.3-LS2.6-RD-1]
D23  esds311dyfr  [SOD-323_L1.7-W1.3-LS2.6-RD-1]
L7  2.2uH/1A  [L0603]
R27  470R  [R0603]
R28  470R  [R0603]
R29  1206-1M  [F1206]
R30  1M  [R0603]
R31  0  [R0603]
R32  0  [R0603]
R33  0  [R0603]
R34  4.7K(NC)  [R0603]
R35  4.7K  [R0603]
R36  0  [R0603]
R37  4.7K  [R0603]
R40  4.7K  [R0603]
R45  4.7K(NC)  [R0603]
R61  4.7K  [R0603]
R62  4.7K  [R0603]
R72  4.7K(NC)  [R0603]
R79  1.5K  [R0603]
R82  0  [R0603]
R90  2.49K  [R0603]
R91  4.7K(NC)  [R0603]
R92  4.7K  [R0603]
R93  0  [R0603]
R94  4.7K  [R0603]
R95  4.7K(NC)  [R0603]
R96  4.7K  [R0603]
R97  4.7K(NC)  [R0603]
R98  0  [R0603]
R99  4.7K  [R0603]
R100  4.7K(NC)  [R0603]
R101  0  [R0603]
R102  4.7K  [R0603]
R103  4.7K(NC)  [R0603]
R104  2.49K  [R0603]
R105  4.7K(NC)  [R0603]
RJ1  hr911130a  [RJ45-TH_HR911130A]
RN4  4d03wgj0330t5e  [RES-ARRAY-SMD_0603-8P-L3.2-W1.6-BL]  (value not drawn)  (parts A,B,C,D of 4)
RN5  4d03wgj0330t5e  [RES-ARRAY-SMD_0603-8P-L3.2-W1.6-BL]  (value not drawn)  (parts A,B,C,D of 4)
RN6  4d03wgj0330t5e  [RES-ARRAY-SMD_0603-8P-L3.2-W1.6-BL]  (value not drawn)  (parts A,B,C,D of 4)
U21  rtl8211fi-cg  [QFN-40_L5.0-W5.0-P0.40-BL-EP3.7]
X3  x322525mob4si  [CRYSTAL-SMD_4P-L3.2-W2.5-BL]

### Nets
+3V3: R36.2 R92.2 R93.2 R95.2 R97.2 R101.2 RJ1.11 RJ1.14
AVDD3V3: C101.2 C113.2 R36.1 U21.11(AVDD33) U21.40(AVDD33)
AVDD10: C115.2 C116.2 C117.2 R82.1 U21.3(AVDD10) U21.8(AVDD10) U21.38(AVDD10)
DVDD3V3: C118.2 C119.2 R93.1 U21.29(DVDD33)
DVDD10: C67.2 R33.1 U21.21(DVDD10)
DVDDRG: C121.2 C122.2 R35.2 R37.1 R45.2 R61.1 R72.2 R79.1 R100.2 R101.1 R103.2 R105.2 U21.28(DVDD_RG)
GND: C35.1 C65.1 C66.1 C67.1 C68.1 C69.1 C70.1 C101.1 C113.1 C115.1 C116.1 C117.1 C118.1 C119.1 C120.1 C121.1 C122.1 D6.2(A) D7.2(A) D14.2(A) D15.2(A) D16.2(A) D17.2(A) D19.2(A) D23.2(A) R29.1 R34.1 R40.1 R62.1 R90.1 R91.1 R94.1 R96.1 R99.1 R102.1 R104.1 U21.41(GND) X3.2(GND) X3.4(GND)
PE: C35.2 C41.1 R29.2 RJ1.P10 RJ1.SHIELD0 RJ1.SHIELD1
ETH_D0N: D19.1(K) RJ1.P3(MDI0-) U21.1(MDIP0)
ETH_D0P: D23.1(K) RJ1.P2(MDI0+) U21.2(MDIN0)
ETH_D1N: D7.1(K) RJ1.P7(MDI1-) U21.4(MDIP1)
ETH_D1P: D6.1(K) RJ1.P4(MDI1+) U21.5(MDIN1)
ETH_D2N: D15.1(K) RJ1.P6(MDI2-) U21.6(MDIP2)
ETH_D2P: D14.1(K) RJ1.P5(MDI2+) U21.7(MDIN2)
ETH_D3N: D17.1(K) RJ1.P9(MDI3-) U21.9(MDIP3)
ETH_D3P: D16.1(K) RJ1.P8(MDI3+) U21.10(MDIN3)
ETH_MCLK_125/25: R98.1
ETH_MDC: U21.14(MDIO)
ETH_MDIO: R79.2 U21.13(MDC)
ETH_NTB: R37.2 U21.31(NTB/PMEB)
ETH_REGOUT: C70.2 L7.1 U21.30(REG_OUT)
ETH_RESET_N: R61.2 R90.2 U21.39(RSET)
ETH_RX_CLK/PHYAD1: R40.2 R45.1 RN4.8 U21.27(PHYAD1)
ETH_TX_CLK: RN6.3 U21.20(TXC)
ETH_TX_EN: RN6.4 U21.19(TXCTL)
ETH_TXD0: RN5.1 U21.18(TXD0)
ETH_TXD1: RN5.2 U21.17(TXD1)
ETH_TXD2: RN5.3 U21.16(TXD2)
ETH_TXD3: RN5.4 U21.15(TXD3)
ETH_XTAL_IN: R32.2 U21.36(XTAL_IN)
ETH_XTAL_OUT: R31.2 U21.37(XTAL_OUT/EXT_CLK)
LED0/CFG_EXT: R91.2 R92.1 U21.32(CFG_EXT)
LED1/CFG_LDO0: R27.2 R94.2 R95.1 U21.33(CFG_LDO0)
LED2/CFG_LDO: R28.2 R96.2 R97.1 U21.34(CFG_LDO1)
MCLK_125/25: C120.2 R98.2 U21.35(CLKOUT)
PHYRSTB: U21.12(PHYRSTB)
RX_CLK: RN4.1
RXC_N: RN4.2
RXCTL/PHYAD2: R62.2 R72.1 RN4.7 U21.26(PHYAD2)
RXD0/RXDLY: R99.2 R100.1 RN4.6 U21.25(RXDLY)
RXD0_N: RN4.3
RXD1/TXDLY: R102.2 R103.1 RN4.5 U21.24(TXDLY)
RXD1_N: RN4.4
RXD2/PLLOFF: R104.2 R105.1 RN6.8 U21.23(PLLOFF)
RXD2_N: RN6.1
RXD3/PHYAD0: R34.2 R35.1 RN6.7 U21.22(PHYAD0)
RXD3_N: RN6.2
TX_CLK: RN6.6
TXC_N: RN6.5
TXD0_N: RN5.8
TXD1_N: RN5.7
TXD2_N: RN5.6
TXD3_N: RN5.5
NetC41_2: C41.2 RJ1.P1
NetC65_2: C65.2 R30.2 R31.1 X3.3(OSC2)
NetC66_2: C66.2 R30.1 R32.1 X3.1(OSC1)
NetC68_2: C68.2 C69.2 L7.2 R33.2 R82.2
NetR27_1: R27.1 RJ1.12
NetR28_1: R28.1 RJ1.13

### Notes on the sheet
- (in symbol hr911130a) Green LED; Yellow LED; J8; J7; J6 RX-; J5; J4; J3 RX+; J2 TX-; J1 TX+; 1000pF; 75ohm; 2KV

### Library data of the parts
C35 = cc1206kkx7rdbb102: 容值:1nF;精度:±10%;额定电压:2kV;温度系数:X7R;; Manufacturer: YAGEO(国巨); AddInBom: yes; ModelId: e4be705b945545a48e666415e3682bd8; ModelName: C1206_L3.2-W1.6-H1.3; ModelTransform: 125.984,62.992,0,0,0,0,0,0,0; Value: 1nF; Tolerance: ±10%; Voltage Rating: 2kV; Temperature Coefficient: X7R; Symbol: CC1206KKX7RDBB102; LCSC Part Name: 1nF ±10% 2kV; SupplierPart: C23631; ManufacturerPart: CC1206KKX7RDBB102; Supplier Footprint: 1206; JLCPCB Part Class: Extended Part; Datasheet: https://item.szlcsc.com/datasheet/CC1206KKX7RDBB102/24367.html; Supplier: LCSC; ConvertToPcb: yes; FootprintName: C1206
C41 C65-C70 C101 C113 C115-C122 = C0603: Capacitor; Value: 104; Published: 8-Jun-2000; LatestRevisionDate: 17-Jul-2002; LatestRevisionNote: Re-released for DXP Platform.; Publisher: Altium Limited
D6 D7 D14-D17 D19 D23 = esds311dyfr: as D10 on sheet SDRAM，JTAG，I2C EEPROM，SD Card; LCSC Part Name: 单向TVS 3.6V截止 峰值浪涌电流：25A@8/20us; SupplierPart: C30938562; ManufacturerPart: ESDS311DYFR; Supplier Footprint: SOD-323; JLCPCB Part Class: Extended Part; Datasheet: https://www.ti.com.cn/cn/lit/ds/symlink/esds311.pdf?ts=1736913524660&ref_url=https%253A%252F%252Fwww.ti.com.cn%252Fsitesearch%252Fzh-cn%252Fdocs%252Funiversalsearch.tsp%253FlangPref%253Dzh-CN%2526nr%253D9%2526searchTerm%253DESDS311DYFR; Supplier: LCSC; ConvertToPcb: yes; SymbolName: ESDS311DYFR; FootprintName: SOD-323_L1.7-W1.3-LS2.6-RD-1; ModelName: SOD-323_L1.7-W1.3-LS2.6-RD-1; Peak Pulse Current (Ipp): 25A@8/20us; Peak Pulse Power Dissipation (Ppp): 170W@8/20us; Operating Temperature: -40℃~+125℃
L7 = L0603: 电感值:10uH;精度:±10%;额定电流:3mA;饱和电流(Isat):-;直流电阻(DCR):1.85Ω;; Manufacturer: Sunlord(顺络); Symbol: SDFL1608S100KTF; AddInBom: yes; ModelId: 2bc5ec593d464d6ba9807aec0b5673c2; ModelName: L0603_L1.6-W0.8-H0.5_BEAD; ModelTransform: 62.992,31.496,0,180,0,0,0.094,0.629,0; Value: 10uH; Tolerance: ±10%; Current Rating: 3mA; DC Resistance(DCR): 1.85Ω; Q @ Frequency: 30@2MHz; Frequency - Self Resonant: 17MHz; LCSC Part Name: 10uH ±10%; SupplierPart: C1035; ManufacturerPart: SDFL1608S100KTF; Supplier Footprint: 0603; JLCPCB Part Class: Basic Part; Datasheet: https://item.szlcsc.com/datasheet/SDFL1608S100KTF/1387.html; Supplier: LCSC; ConvertToPcb: yes; FootprintName: L0603; Current - Saturation (Isat): -; Ratings: -
R27 R28 R30-R37 R40 R45 R61 R62 R72 R79 R82 R90-R105 = R0603: Resistor; Published: 8-Jun-2000; LatestRevisionDate: 17-Jul-2002; LatestRevisionNote: Re-released for DXP Platform.; Publisher: Altium Limited
R29 = R1206: 特性：I Hold：0.05 ~ 3.0A。 快速响应故障电流。 尺寸1206 / 3.2×1.6mm。 低电阻。 低轮廓。 符合RoHS标准，无铅且无卤。应用：USB集线器、端口和外围设备。 计算机、手机、多媒体设备; Published: 8-Jun-2000; LatestRevisionDate: 17-Jul-2002; LatestRevisionNote: Re-released for DXP Platform.; Publisher: Altium Limited
RJ1 = hr911130a: 连接器类型:RJ45插座;安装方式:弯插;端口数量:1;LED:带LED;屏蔽:有屏蔽;等级:-;触头材质:磷青铜;触头镀层:金;工作温度:0℃~+70℃;; Manufacturer: HANRUN(汉仁); AddInBom: yes; ModelId: 21112b2bcfef4316930bd636ff253b92; ModelTransform: 635.432,838.62,0,180,0,0,0,88.937,-157.48; Connector Type: RJ45插座; Number of Ports: 1; LED: 带LED; Shielding: 有屏蔽; PoE: 不带PoE; Supplementary Features: 带十字脚; Symbol: HR911130A; LCSC Part Name: 弯插 带LED; SupplierPart: C54408; ManufacturerPart: HR911130A; Supplier Footprint: 插件; JLCPCB Part Class: Extended Part; Datasheet: https://item.szlcsc.com/datasheet/HR911130A/55426.html; Supplier: LCSC; ConvertToPcb: yes; FootprintName: RJ45-TH_HR911130A; ModelName: RJ45-TH_HR911130A; Mounting Type: 弯插; Ratings: -; Contact Material: 磷青铜; Contact Plating: 金; Operating Temperature: 0℃~+70℃; Length: 21.2mm; Width: 16mm; Height: 13.3mm
RN4-RN6 = 4d03wgj0330t5e: 电阻器数:4;阻值:33Ω;精度:±5%;单个元件功率:62.5mW;温度系数:±200ppm/℃;; Manufacturer: UNI-ROYAL(厚声); AddInBom: yes; ModelId: edf39f9a2dca4b9a94267f442dd4f95a; ModelName: R0603-8P_L3.2-W1.6-H0.6; ModelTransform: 125.984,62.992,0,0,0,0,0,0,0; Number of Resistors: 4; Value: 33Ω; Tolerance: ±5%; Power(Watts): 62.5mW; Symbol: 4D03WGJ0330T5E; LCSC Part Name: 33Ω ±5%; SupplierPart: C25508; ManufacturerPart: 4D03WGJ0330T5E; Supplier Footprint: 0603x4; JLCPCB Part Class: Extended Part; Datasheet: https://atta.szlcsc.com/upload/public/pdf/source/20191224/C474318_2527498AE30E813171187CCD28401A71.pdf; Supplier: LCSC; ConvertToPcb: yes; FootprintName: RES-ARRAY-SMD_0603-8P-L3.2-W1.6-BL; Temperature Coefficient: ±200ppm/℃; Number of Pins: 8
U21 = rtl8211fi-cg: 类型:以太网收发器;端口数量:-;MAC接口:RGMII;; Manufacturer: REALTEK(瑞昱); AddInBom: yes; ModelId: f658c93bb71c4057b80d8d21cfcdd805; ModelName: QFN-40_L5.0-W5.0-H0.9-P0.4-BL-EP; ModelTransform: 196.85,196.85,0,90,0,0,0,0,0; MAC Interface: RGMII; Ethernet Speed Standards: 1000BASE-T；10BASE-T；100BASE-TX; Data Rate: 10Mbit/s；100Mbit/s；1Gbit/s; Voltage - Supply: 1.8V；2.5V；3.3V；1.5V; Symbol: RTL8211FI-CG; LCSC Part Name: 集成10/100/1000M以太网精密收发器; SupplierPart: C717681; ManufacturerPart: RTL8211FI-CG; Supplier Footprint: QFN-40-EP(5x5); JLCPCB Part Class: Extended Part; Supplier: LCSC; ConvertToPcb: yes; FootprintName: QFN-40_L5.0-W5.0-P0.40-BL-EP3.7; Type: 以太网收发器; Number of ports: -
X3 = x322525mob4si: 晶振类型:贴片晶振;频率:25MHz;常温频差:±10ppm;负载电容:12pF;频率稳定度:±20ppm;; Manufacturer: YXC(扬兴晶振); AddInBom: yes; ModelId: ff2dfd5650294453a14147960efe1838; ModelTransform: 125.984,98.425,0,0,0,0,0,0,0; Value: 25MHz; Normal temperature Frequency Tolerance: ±10ppm; Load Capacitance: 12pF; Frequency Stability: ±20ppm; Symbol: X322525MOB4SI; LCSC Part Name: YSX321SL 25MHZ 4P 3225 12PF ±10PPM -40~85℃ (±20PPM); SupplierPart: C9006; ManufacturerPart: X322525MOB4SI; Supplier Footprint: SMD3225-4P; JLCPCB Part Class: Basic Part; Datasheet: https://item.szlcsc.com/datasheet/X322525MOB4SI/9526.html; Supplier: LCSC; ConvertToPcb: yes; FootprintName: CRYSTAL-SMD_4P-L3.2-W2.5-BL; ModelName: CRYSTAL-SMD_4P-L3.2-W2.5-BL; Type: 贴片晶振; Operating Temperature: -40℃~+85℃

## Sheet Ethernet_PHY_2.SchDoc
size A4; SheetNumber: 6; SheetTotal: 16
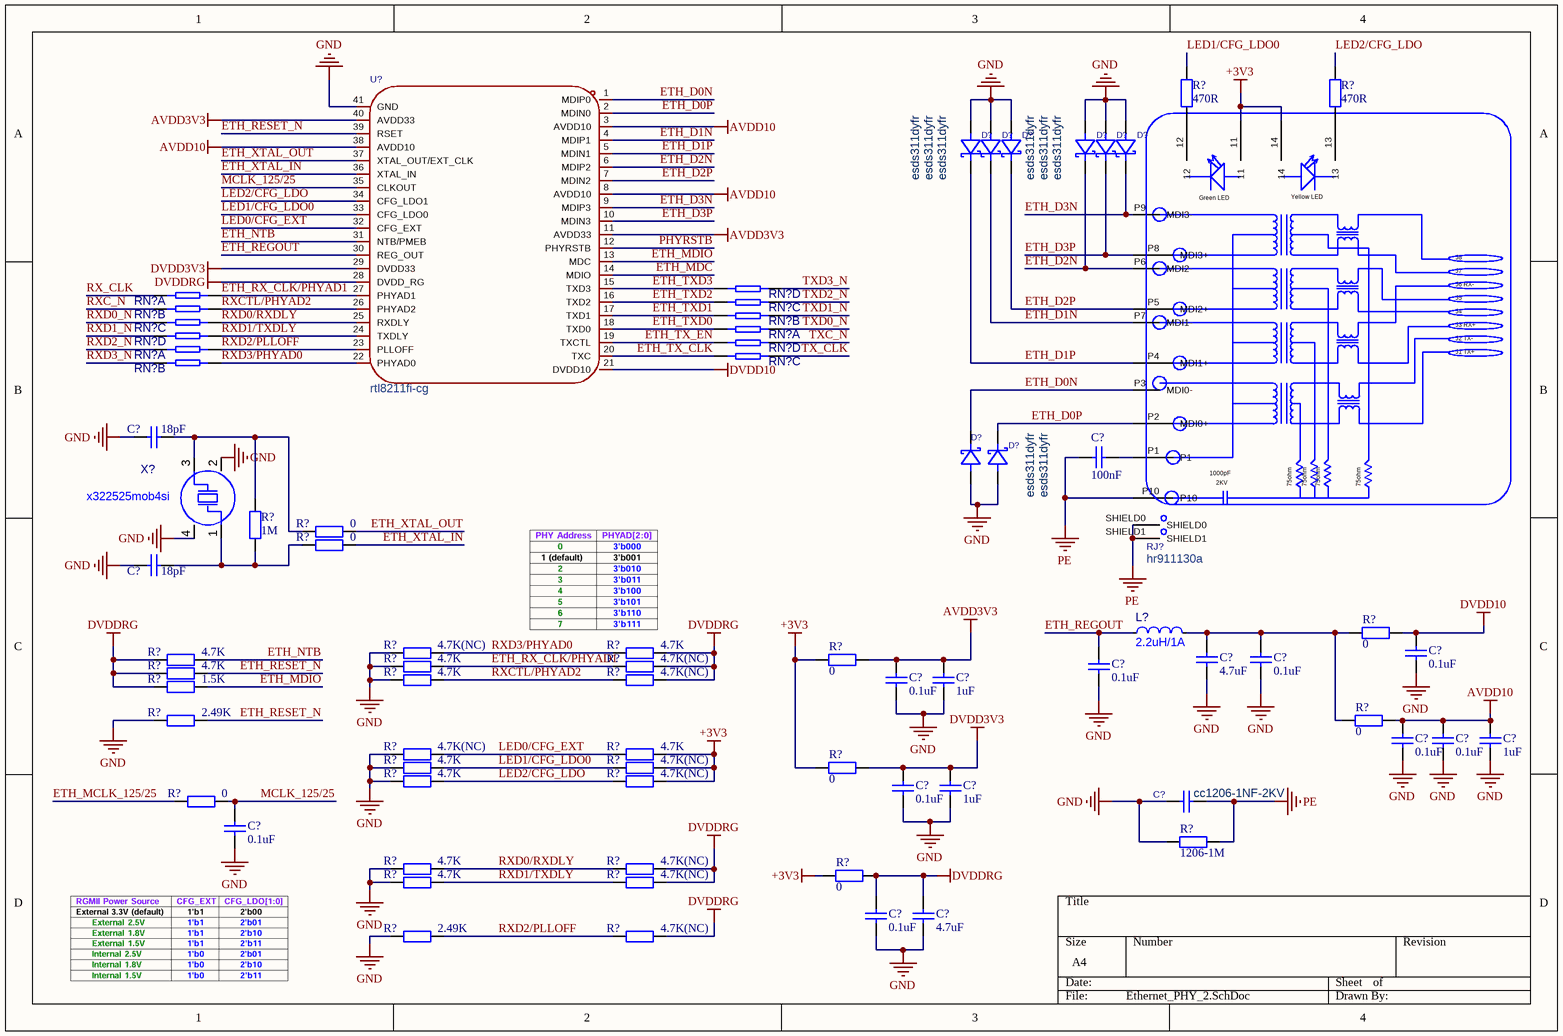
[diagram p4: Ethernet_PHY_2.SchDoc]

### Parts
(Parts that share a designator on the sheet are numbered #1, #2 ... from top to bottom, then left to right.)
C?#1  18pF  [C0603]
C?#2  100nF  [C0603]
C?#3  18pF  [C0603]
C?#4  0.1uF  [C0603]
C?#5  4.7uF  [C0603]
C?#6  0.1uF  [C0603]
C?#7  0.1uF  [C0603]
C?#8  0.1uF  [C0603]
C?#9  1uF  [C0603]
C?#10  0.1uF  [C0603]
C?#11  0.1uF  [C0603]
C?#12  1uF  [C0603]
C?#13  0.1uF  [C0603]
C?#14  1uF  [C0603]
C?#15  cc1206-1NF-2KV  [C1206]
C?#16  0.1uF  [C0603]
C?#17  0.1uF  [C0603]
C?#18  4.7uF  [C0603]
D?#1  esds311dyfr  [SOD-323_L1.7-W1.3-LS2.6-RD-1]
D?#2  esds311dyfr  [SOD-323_L1.7-W1.3-LS2.6-RD-1]
D?#3  esds311dyfr  [SOD-323_L1.7-W1.3-LS2.6-RD-1]
D?#4  esds311dyfr  [SOD-323_L1.7-W1.3-LS2.6-RD-1]
D?#5  esds311dyfr  [SOD-323_L1.7-W1.3-LS2.6-RD-1]
D?#6  esds311dyfr  [SOD-323_L1.7-W1.3-LS2.6-RD-1]
D?#7  esds311dyfr  [SOD-323_L1.7-W1.3-LS2.6-RD-1]
D?#8  esds311dyfr  [SOD-323_L1.7-W1.3-LS2.6-RD-1]
L?#1  2.2uH/1A  [L0603]
R?#12  470R  [R0603]
R?#13  470R  [R0603]
R?#14  0  [R0603]
R?#15  0  [R0603]
R?#16  1M  [R0603]
R?#17  4.7K(NC)  [R0603]
R?#18  4.7K  [R0603]
R?#19  4.7K  [R0603]
R?#20  0  [R0603]
R?#21  4.7K  [R0603]
R?#22  4.7K(NC)  [R0603]
R?#23  4.7K  [R0603]
R?#24  4.7K  [R0603]
R?#25  4.7K(NC)  [R0603]
R?#26  1.5K  [R0603]
R?#27  0  [R0603]
R?#28  2.49K  [R0603]
R?#29  0  [R0603]
R?#30  4.7K(NC)  [R0603]
R?#31  4.7K  [R0603]
R?#32  4.7K  [R0603]
R?#33  4.7K(NC)  [R0603]
R?#34  4.7K  [R0603]
R?#35  4.7K(NC)  [R0603]
R?#36  0  [R0603]
R?#37  0  [R0603]
R?#38  1206-1M  [F1206]
R?#39  4.7K  [R0603]
R?#40  4.7K(NC)  [R0603]
R?#41  4.7K  [R0603]
R?#42  4.7K(NC)  [R0603]
R?#43  0  [R0603]
R?#44  2.49K  [R0603]
R?#45  4.7K(NC)  [R0603]
RJ?  hr911130a  [RJ45-TH_HR911130A]
RN?#1  4d03wgj0330t5e  [RES-ARRAY-SMD_0603-8P-L3.2-W1.6-BL]  (value not drawn)  (part A of 4)
RN?#2  4d03wgj0330t5e  [RES-ARRAY-SMD_0603-8P-L3.2-W1.6-BL]  (value not drawn)  (part D of 4)
RN?#3  4d03wgj0330t5e  [RES-ARRAY-SMD_0603-8P-L3.2-W1.6-BL]  (value not drawn)  (part C of 4)
RN?#4  4d03wgj0330t5e  [RES-ARRAY-SMD_0603-8P-L3.2-W1.6-BL]  (value not drawn)  (part B of 4)
RN?#5  4d03wgj0330t5e  [RES-ARRAY-SMD_0603-8P-L3.2-W1.6-BL]  (value not drawn)  (part B of 4)
RN?#6  4d03wgj0330t5e  [RES-ARRAY-SMD_0603-8P-L3.2-W1.6-BL]  (value not drawn)  (part C of 4)
RN?#7  4d03wgj0330t5e  [RES-ARRAY-SMD_0603-8P-L3.2-W1.6-BL]  (value not drawn)  (part A of 4)
RN?#8  4d03wgj0330t5e  [RES-ARRAY-SMD_0603-8P-L3.2-W1.6-BL]  (value not drawn)  (part D of 4)
RN?#9  4d03wgj0330t5e  [RES-ARRAY-SMD_0603-8P-L3.2-W1.6-BL]  (value not drawn)  (part A of 4)
RN?#10  4d03wgj0330t5e  [RES-ARRAY-SMD_0603-8P-L3.2-W1.6-BL]  (value not drawn)  (part D of 4)
RN?#11  4d03wgj0330t5e  [RES-ARRAY-SMD_0603-8P-L3.2-W1.6-BL]  (value not drawn)  (part C of 4)
RN?#12  4d03wgj0330t5e  [RES-ARRAY-SMD_0603-8P-L3.2-W1.6-BL]  (value not drawn)  (part B of 4)
U?#1  rtl8211fi-cg  [QFN-40_L5.0-W5.0-P0.40-BL-EP3.7]
X?  x322525mob4si  [CRYSTAL-SMD_4P-L3.2-W2.5-BL]

### Nets
+3V3: R?#27.2 R?#31.2 R?#33.2 R?#35.2 R?#36.2 R?#43.2 RJ?.11 RJ?.14
AVDD3V3: C?#8.2 C?#9.2 R?#27.1 U?#1.11(AVDD33) U?#1.40(AVDD33)
AVDD10: C?#10.2 C?#11.2 C?#12.2 R?#29.1 U?#1.3(AVDD10) U?#1.8(AVDD10) U?#1.38(AVDD10)
DVDD3V3: C?#13.2 C?#14.2 R?#36.1 U?#1.29(DVDD33)
DVDD10: C?#4.2 R?#20.1 U?#1.21(DVDD10)
DVDDRG: C?#17.2 C?#18.2 R?#18.2 R?#19.1 R?#22.2 R?#23.1 R?#25.2 R?#26.1 R?#40.2 R?#42.2 R?#43.1 R?#45.2 U?#1.28(DVDD_RG)
GND: C?#1.1 C?#3.1 C?#4.1 C?#5.1 C?#6.1 C?#7.1 C?#8.1 C?#9.1 C?#10.1 C?#11.1 C?#12.1 C?#13.1 C?#14.1 C?#15.1 C?#16.1 C?#17.1 C?#18.1 D?#1.2(A) D?#2.2(A) D?#3.2(A) D?#4.2(A) D?#5.2(A) D?#6.2(A) D?#7.2(A) D?#8.2(A) R?#17.1 R?#21.1 R?#24.1 R?#28.1 R?#30.1 R?#32.1 R?#34.1 R?#38.1 R?#39.1 R?#41.1 R?#44.1 U?#1.41(GND) X?.2(GND) X?.4(GND)
PE: C?#2.1 C?#15.2 R?#38.2 RJ?.P10 RJ?.SHIELD0 RJ?.SHIELD1
ETH_D0N: D?#7.1(K) RJ?.P3(MDI0-) U?#1.1(MDIP0)
ETH_D0P: D?#8.1(K) RJ?.P2(MDI0+) U?#1.2(MDIN0)
ETH_D1N: D?#2.1(K) RJ?.P7(MDI1-) U?#1.4(MDIP1)
ETH_D1P: D?#1.1(K) RJ?.P4(MDI1+) U?#1.5(MDIN1)
ETH_D2N: D?#4.1(K) RJ?.P6(MDI2-) U?#1.6(MDIP2)
ETH_D2P: D?#3.1(K) RJ?.P5(MDI2+) U?#1.7(MDIN2)
ETH_D3N: D?#6.1(K) RJ?.P9(MDI3-) U?#1.9(MDIP3)
ETH_D3P: D?#5.1(K) RJ?.P8(MDI3+) U?#1.10(MDIN3)
ETH_MCLK_125/25: R?#37.1
ETH_MDC: U?#1.14(MDIO)
ETH_MDIO: R?#26.2 U?#1.13(MDC)
ETH_NTB: R?#19.2 U?#1.31(NTB/PMEB)
ETH_REGOUT: C?#7.2 L?#1.1 U?#1.30(REG_OUT)
ETH_RESET_N: R?#23.2 R?#28.2 U?#1.39(RSET)
ETH_RX_CLK/PHYAD1: R?#21.2 R?#22.1 RN?#1.8 U?#1.27(PHYAD1)
ETH_TX_CLK: RN?#11.3 U?#1.20(TXC)
ETH_TX_EN: RN?#10.4 U?#1.19(TXCTL)
ETH_TXD0: RN?#7.1 U?#1.18(TXD0)
ETH_TXD1: RN?#5.2 U?#1.17(TXD1)
ETH_TXD2: RN?#3.3 U?#1.16(TXD2)
ETH_TXD3: RN?#2.4 U?#1.15(TXD3)
ETH_XTAL_IN: R?#15.2 U?#1.36(XTAL_IN)
ETH_XTAL_OUT: R?#14.2 U?#1.37(XTAL_OUT/EXT_CLK)
LED0/CFG_EXT: R?#30.2 R?#31.1 U?#1.32(CFG_EXT)
LED1/CFG_LDO0: R?#12.2 R?#32.2 R?#33.1 U?#1.33(CFG_LDO0)
LED2/CFG_LDO: R?#13.2 R?#34.2 R?#35.1 U?#1.34(CFG_LDO1)
MCLK_125/25: C?#16.2 R?#37.2 U?#1.35(CLKOUT)
PHYRSTB: U?#1.12(PHYRSTB)
RX_CLK: RN?#1.1
RXC_N: RN?#4.2
RXCTL/PHYAD2: R?#24.2 R?#25.1 RN?#4.7 U?#1.26(PHYAD2)
RXD0/RXDLY: R?#39.2 R?#40.1 RN?#6.6 U?#1.25(RXDLY)
RXD0_N: RN?#6.3
RXD1/TXDLY: R?#41.2 R?#42.1 RN?#8.5 U?#1.24(TXDLY)
RXD1_N: RN?#8.4
RXD2/PLLOFF: R?#44.2 R?#45.1 RN?#9.8 U?#1.23(PLLOFF)
RXD2_N: RN?#9.1
RXD3/PHYAD0: R?#17.2 R?#18.1 RN?#12.7 U?#1.22(PHYAD0)
RXD3_N: RN?#12.2
TX_CLK: RN?#11.6
TXC_N: RN?#10.5
TXD0_N: RN?#7.8
TXD1_N: RN?#5.7
TXD2_N: RN?#3.6
TXD3_N: RN?#2.5
NetC?#1_2: C?#1.2 R?#14.1 R?#16.2 X?.3(OSC2)
NetC?#2_2: C?#2.2 RJ?.P1
NetC?#3_2: C?#3.2 R?#15.1 R?#16.1 X?.1(OSC1)
NetC?#5_2: C?#5.2 C?#6.2 L?#1.2 R?#20.2 R?#29.2
NetR?#12_1: R?#12.1 RJ?.12
NetR?#13_1: R?#13.1 RJ?.13

### Notes on the sheet
- (in symbol hr911130a) Green LED; Yellow LED; J8; J7; J6 RX-; J5; J4; J3 RX+; J2 TX-; J1 TX+; 1000pF; 75ohm; 2KV

### Library data of the parts
C?#1-C?#14 C?#16-C?#18 = C0603: Capacitor; Value: 104; Published: 8-Jun-2000; LatestRevisionDate: 17-Jul-2002; LatestRevisionNote: Re-released for DXP Platform.; Publisher: Altium Limited
C?#15 = cc1206kkx7rdbb102: as C35 on sheet Ethernet_PHY_1; Symbol: CC1206KKX7RDBB102; LCSC Part Name: 1nF ±10% 2kV; SupplierPart: C23631; ManufacturerPart: CC1206KKX7RDBB102; Supplier Footprint: 1206; JLCPCB Part Class: Extended Part; Datasheet: https://item.szlcsc.com/datasheet/CC1206KKX7RDBB102/24367.html; Supplier: LCSC; ConvertToPcb: yes; FootprintName: C1206
D?#1-D?#8 = esds311dyfr: as D10 on sheet SDRAM，JTAG，I2C EEPROM，SD Card; LCSC Part Name: 单向TVS 3.6V截止 峰值浪涌电流：25A@8/20us; SupplierPart: C30938562; ManufacturerPart: ESDS311DYFR; Supplier Footprint: SOD-323; JLCPCB Part Class: Extended Part; Datasheet: https://www.ti.com.cn/cn/lit/ds/symlink/esds311.pdf?ts=1736913524660&ref_url=https%253A%252F%252Fwww.ti.com.cn%252Fsitesearch%252Fzh-cn%252Fdocs%252Funiversalsearch.tsp%253FlangPref%253Dzh-CN%2526nr%253D9%2526searchTerm%253DESDS311DYFR; Supplier: LCSC; ConvertToPcb: yes; SymbolName: ESDS311DYFR; FootprintName: SOD-323_L1.7-W1.3-LS2.6-RD-1; ModelName: SOD-323_L1.7-W1.3-LS2.6-RD-1; Peak Pulse Current (Ipp): 25A@8/20us; Peak Pulse Power Dissipation (Ppp): 170W@8/20us; Operating Temperature: -40℃~+125℃
L?#1 = L0603: as L7 on sheet Ethernet_PHY_1; LCSC Part Name: 10uH ±10%; SupplierPart: C1035; ManufacturerPart: SDFL1608S100KTF; Supplier Footprint: 0603; JLCPCB Part Class: Basic Part; Datasheet: https://item.szlcsc.com/datasheet/SDFL1608S100KTF/1387.html; Supplier: LCSC; ConvertToPcb: yes; FootprintName: L0603; Current - Saturation (Isat): -; Ratings: -
R?#12-R?#37 R?#39-R?#45 = R0603: Resistor; Published: 8-Jun-2000; LatestRevisionDate: 17-Jul-2002; LatestRevisionNote: Re-released for DXP Platform.; Publisher: Altium Limited
R?#38 = R1206: as R29 on sheet Ethernet_PHY_1; Published: 8-Jun-2000; LatestRevisionDate: 17-Jul-2002; LatestRevisionNote: Re-released for DXP Platform.; Publisher: Altium Limited
RJ? = hr911130a: as RJ1 on sheet Ethernet_PHY_1; Symbol: HR911130A; LCSC Part Name: 弯插 带LED; SupplierPart: C54408; ManufacturerPart: HR911130A; Supplier Footprint: 插件; JLCPCB Part Class: Extended Part; Datasheet: https://item.szlcsc.com/datasheet/HR911130A/55426.html; Supplier: LCSC; ConvertToPcb: yes; FootprintName: RJ45-TH_HR911130A; ModelName: RJ45-TH_HR911130A; Mounting Type: 弯插; Ratings: -; Contact Material: 磷青铜; Contact Plating: 金; Operating Temperature: 0℃~+70℃; Length: 21.2mm; Width: 16mm; Height: 13.3mm
RN?#1-RN?#12 = 4d03wgj0330t5e: as RN4 on sheet Ethernet_PHY_1; Symbol: 4D03WGJ0330T5E; LCSC Part Name: 33Ω ±5%; SupplierPart: C25508; ManufacturerPart: 4D03WGJ0330T5E; Supplier Footprint: 0603x4; JLCPCB Part Class: Extended Part; Datasheet: https://atta.szlcsc.com/upload/public/pdf/source/20191224/C474318_2527498AE30E813171187CCD28401A71.pdf; Supplier: LCSC; ConvertToPcb: yes; FootprintName: RES-ARRAY-SMD_0603-8P-L3.2-W1.6-BL; Temperature Coefficient: ±200ppm/℃; Number of Pins: 8
U?#1 = rtl8211fi-cg: as U21 on sheet Ethernet_PHY_1; Symbol: RTL8211FI-CG; LCSC Part Name: 集成10/100/1000M以太网精密收发器; SupplierPart: C717681; ManufacturerPart: RTL8211FI-CG; Supplier Footprint: QFN-40-EP(5x5); JLCPCB Part Class: Extended Part; Supplier: LCSC; ConvertToPcb: yes; FootprintName: QFN-40_L5.0-W5.0-P0.40-BL-EP3.7; Type: 以太网收发器; Number of ports: -
X? = x322525mob4si: as X3 on sheet Ethernet_PHY_1; Symbol: X322525MOB4SI; LCSC Part Name: YSX321SL 25MHZ 4P 3225 12PF ±10PPM -40~85℃ (±20PPM); SupplierPart: C9006; ManufacturerPart: X322525MOB4SI; Supplier Footprint: SMD3225-4P; JLCPCB Part Class: Basic Part; Datasheet: https://item.szlcsc.com/datasheet/X322525MOB4SI/9526.html; Supplier: LCSC; ConvertToPcb: yes; FootprintName: CRYSTAL-SMD_4P-L3.2-W2.5-BL; ModelName: CRYSTAL-SMD_4P-L3.2-W2.5-BL; Type: 贴片晶振; Operating Temperature: -40℃~+85℃

## Sheet TYPE-C.SchDoc
size A4; SheetNumber: 7; SheetTotal: 13
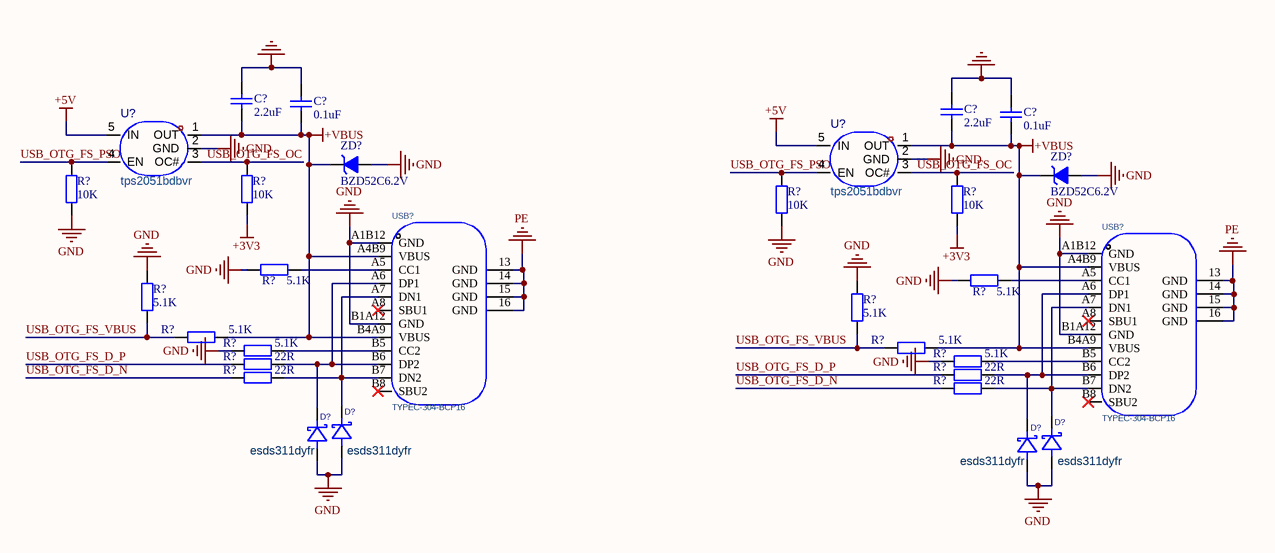
[diagram p5: TYPE-C.SchDoc]

### Parts
(Parts that share a designator on the sheet are numbered #1, #2 ... from top to bottom, then left to right.)
C?#19  2.2uF  [C0603]
C?#20  0.1uF  [C0603]
C?#21  2.2uF  [C0603]
C?#22  0.1uF  [C0603]
D?#9  esds311dyfr  [SOD-323_L1.7-W1.3-LS2.6-RD-1]
D?#10  esds311dyfr  [SOD-323_L1.7-W1.3-LS2.6-RD-1]
D?#11  esds311dyfr  [SOD-323_L1.7-W1.3-LS2.6-RD-1]
D?#12  esds311dyfr  [SOD-323_L1.7-W1.3-LS2.6-RD-1]
R?#46  10K  [R0603]
R?#47  10K  [R0603]
R?#48  10K  [R0603]
R?#49  10K  [R0603]
R?#50  5.1K  [R0603]
R?#51  5.1K  [R0603]
R?#52  5.1K  [R0603]
R?#53  5.1K  [R0603]
R?#54  5.1K  [R0603]
R?#55  5.1K  [R0603]
R?#56  5.1K  [R0603]
R?#57  22R  [R0603]
R?#58  5.1K  [R0603]
R?#59  22R  [R0603]
R?#60  22R  [R0603]
R?#61  22R  [R0603]
U?#2  tps2051bdbvr  [SOT-23-5_L3.0-W1.7-P0.95-LS2.8-BR]
U?#3  tps2051bdbvr  [SOT-23-5_L3.0-W1.7-P0.95-LS2.8-BR]
USB?#1  TYPEC-304-BCP16  [USB-C-SMD_TYPEC-304-BCP16]
USB?#2  TYPEC-304-BCP16  [USB-C-SMD_TYPEC-304-BCP16]
ZD?#1  BZD52C6.2V  [SOD-123_L2.7-W1.6-LS3.7-RD]
ZD?#2  BZD52C6.2V  [SOD-123_L2.7-W1.6-LS3.7-RD]

### Nets
+3V3: R?#48.1 R?#49.1
+5V: U?#2.5(IN) U?#3.5(IN)
+VBUS: C?#19.2 C?#20.2 C?#21.2 C?#22.2 R?#54.2 R?#55.2 U?#2.1(OUT) U?#3.1(OUT) USB?#1.A4B9(VBUS) USB?#1.B4A9(VBUS) USB?#2.A4B9(VBUS) USB?#2.B4A9(VBUS) ZD?#1.1 ZD?#2.1
GND: D?#9.2(A) D?#10.2(A) D?#11.2(A) D?#12.2(A) R?#46.2 R?#47.2 R?#50.1 R?#51.2 R?#52.1 R?#53.2 R?#56.2 R?#58.2 U?#2.2(GND) U?#3.2(GND) USB?#1.A1B12(GND) USB?#1.B1A12(GND) USB?#2.A1B12(GND) USB?#2.B1A12(GND) ZD?#1.2 ZD?#2.2
NetC?#19_1: C?#19.1 C?#20.1 C?#21.1 C?#22.1
PE: USB?#1.13(GND) USB?#1.14(GND) USB?#1.15(GND) USB?#1.16(GND) USB?#2.13(GND) USB?#2.14(GND) USB?#2.15(GND) USB?#2.16(GND)
USB_OTG_FS_D_N: R?#59.2 R?#61.2
USB_OTG_FS_D_P: R?#57.2 R?#60.2
USB_OTG_FS_OC: R?#48.2 R?#49.2 U?#2.3(OC#) U?#3.3(OC#)
USB_OTG_FS_PSO: R?#46.1 R?#47.1 U?#2.4(EN) U?#3.4(EN)
USB_OTG_FS_VBUS: R?#50.2 R?#52.2 R?#54.1 R?#55.1
NetD?#9_1: D?#9.1(K) R?#59.1 USB?#1.A7(DN1) USB?#1.B7(DN2)
NetD?#10_1: D?#10.1(K) R?#57.1 USB?#1.A6(DP1) USB?#1.B6(DP2)
NetD?#11_1: D?#11.1(K) R?#60.1 USB?#2.A6(DP1) USB?#2.B6(DP2)
NetD?#12_1: D?#12.1(K) R?#61.1 USB?#2.A7(DN1) USB?#2.B7(DN2)
NetR?#51_1: R?#51.1 USB?#1.A5(CC1)
NetR?#53_1: R?#53.1 USB?#2.A5(CC1)
NetR?#56_1: R?#56.1 USB?#1.B5(CC2)
NetR?#58_1: R?#58.1 USB?#2.B5(CC2)

Not connected (* = marked no-connect by the designer): USB?#1 A8(SBU1)* B8(SBU2)*; USB?#2 A8(SBU1)* B8(SBU2)*

### Library data of the parts
C?#19-C?#22 = C0603: Capacitor; Value: 104; Published: 8-Jun-2000; LatestRevisionDate: 17-Jul-2002; LatestRevisionNote: Re-released for DXP Platform.; Publisher: Altium Limited
D?#9-D?#12 = esds311dyfr: as D10 on sheet SDRAM，JTAG，I2C EEPROM，SD Card; LCSC Part Name: 单向TVS 3.6V截止 峰值浪涌电流：25A@8/20us; SupplierPart: C30938562; ManufacturerPart: ESDS311DYFR; Supplier Footprint: SOD-323; JLCPCB Part Class: Extended Part; Datasheet: https://www.ti.com.cn/cn/lit/ds/symlink/esds311.pdf?ts=1736913524660&ref_url=https%253A%252F%252Fwww.ti.com.cn%252Fsitesearch%252Fzh-cn%252Fdocs%252Funiversalsearch.tsp%253FlangPref%253Dzh-CN%2526nr%253D9%2526searchTerm%253DESDS311DYFR; Supplier: LCSC; ConvertToPcb: yes; SymbolName: ESDS311DYFR; FootprintName: SOD-323_L1.7-W1.3-LS2.6-RD-1; ModelName: SOD-323_L1.7-W1.3-LS2.6-RD-1; Peak Pulse Current (Ipp): 25A@8/20us; Peak Pulse Power Dissipation (Ppp): 170W@8/20us; Operating Temperature: -40℃~+125℃
R?#46-R?#61 = R0603: RES 5.1K OHM 1/10W 1% 0603 SMD; Published: 8-Jun-2000; LatestRevisionDate: 17-Jul-2002; LatestRevisionNote: Re-released for DXP Platform.; Publisher: Altium Limited
U?#2 U?#3 = tps2051bdbvr: 类型:高侧开关;通道数:1;输入控制逻辑:高电平有效;工作电压:2.7V~5.5V;最大连续电流:500mA;导通电阻:95mΩ;; Manufacturer: TI(德州仪器); AddInBom: yes; ModelId: 0a2a1b8f50944f73965918ad6e5fe167; ModelName: SOT-23-5_L2.9-W1.6-H1.1-LS2.8-P0.95; ModelTransform: 114.173,109.636,0,180,0,0,0,0,0; Number of Channels: 1; Control Input Logic: 高电平有效; Maximum Continuous Current: 500mA; RDS(on): 95mΩ; Symbol: TPS2051BDBVR; LCSC Part Name: 电流限制型功率分配开关; SupplierPart: C24593; ManufacturerPart: TPS2051BDBVR; Supplier Footprint: SOT-23-5; JLCPCB Part Class: Extended Part; Datasheet: https://www.ti.com/cn/lit/ds/symlink/tps2051b.pdf; Supplier: LCSC; ConvertToPcb: yes; FootprintName: SOT-23-5_L3.0-W1.7-P0.95-LS2.8-BR; Type: 高侧开关; Voltage - Supply: 2.7V~5.5V; Features: 短路保护；过流保护；过温保护；集成电荷泵；反向电流阻断；欠压锁定; Operating Temperature	-: -40℃~+85℃
USB?#1 USB?#2 = TYPEC-304-BCP16_C720629: Manufacturer: XUNPU(讯普); Add into BOM: yes; Connector Type: Type-C; Protocol Standard: USB 3.1; Gender: 母; Number of Contacts: 16P; Number of Ports: 1; Current Rating-Power: 3A; Symbol: TYPEC-304-BCP16; Device: TYPEC-304-BCP16_C720629; LCSC Part Name: 停产 Type-C 母 卧贴; Supplier Part: C720629; Manufacturer Part: TYPEC-304-BCP16; Supplier Footprint: SMD; JLCPCB Part Class: Extended Part; Datasheet: https://atta.szlcsc.com/upload/public/pdf/source/20220210/1FE0FEFF7D6A20C111212527D3DED014.pdf; Supplier: LCSC; Convert to PCB: yes; Mounting Type: 卧贴; Operating Temperature: -25℃~+85℃
ZD?#1 ZD?#2 = DIO_ZENER_6: 9V稳压管; Brand: 10V; Part Number: *